# Altium project KOM_ACB23_4009.PrjPcb (part 1 of 2)
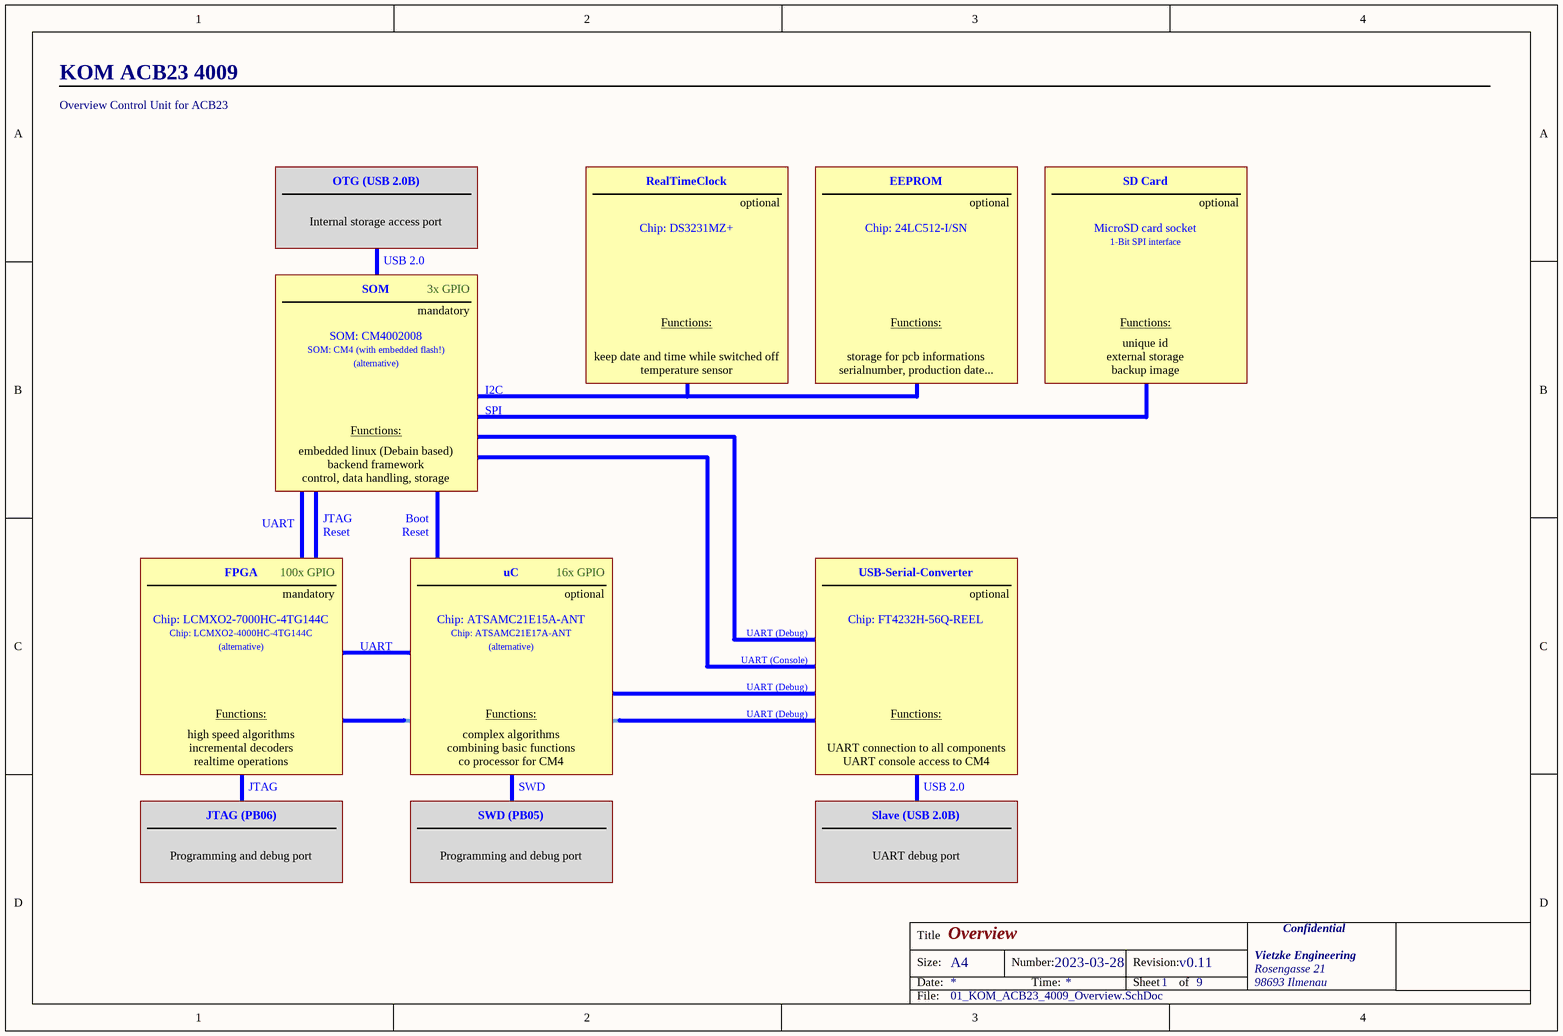
[diagram p0: 01_KOM_ACB23_4009_Overview.SchDoc]
9 sheets, 118 parts. Net scope: flat (ports and power ports of the same name join across sheets).
Board file: ZZ_KOM_ACB23_4009.PcbDoc
Sheets:
  01_KOM_ACB23_4009_Overview.SchDoc
  02_KOM_ACB23_4009_Overview_PCB.SchDoc
  03_KOM_ACB23_4009_Remarks.SchDoc
  04_KOM_ACB23_4009_AdditionalComponents.SchDoc
  05_KOM_ACB23_4009_MicroController.SchDoc
  06_KOM_ACB23_4009_FPGA.SchDoc
  07_KOM_ACB23_4009_ComputeModule.SchDoc
  08_KOM_ACB23_4009_Connectors.SchDoc
  09_KOM_ACB23_4009_Periphery.SchDoc

## Sheet 01_KOM_ACB23_4009_Overview.SchDoc: Overview
size A4; DocumentNumber: 2023-03-28; Revision: v0.11; SheetNumber: 1; SheetTotal: 9

### Notes on the sheet
- KOM ACB23 4009
- Overview Control Unit for ACB23
- OTG (USB 2.0B)
- RealTimeClock
- EEPROM
- SD Card
- Internal storage access port
- Chip: DS3231MZ+
- optional
- Chip: 24LC512-I/SN
- MicroSD card socket
- 1-Bit SPI interface
- SOM
- USB 2.0
- mandatory
- 3x GPIO
- SOM: CM4002008
- SOM: CM4 (with embedded flash!)
- (alternative)
- I2C
- keep date and time while switched off
- Functions:
- temperature sensor
- storage for pcb informations
- serialnumber, production date...
- backup image
- external storage
- unique id
- embedded linux (Debain based)
- SPI
- JTAG
- control, data handling, storage
- backend framework
- Boot
- FPGA
- UART
- Reset
- 100x GPIO
- uC
- 16x GPIO
- USB-Serial-Converter
- Chip: LCMXO2-7000HC-4TG144C
- Chip: LCMXO2-4000HC-4TG144C
- Chip: ATSAMC21E15A-ANT
- Chip: ATSAMC21E17A-ANT
- UART (Debug)
- UART (Console)
- Chip: FT4232H-56Q-REEL
- realtime operations
- incremental decoders
- high speed algorithms
- co processor for CM4
- combining basic functions
- complex algorithms
- SWD
- UART console access to CM4
- UART connection to all components
- JTAG (PB06)
- Programming and debug port
- SWD (PB05)
- Slave (USB 2.0B)
- UART debug port
- Title
- Size:
- Date:
- A4
- Number:
- Time:
- Revision:
- Sheet
- of
- Vietzke Engineering
- Rosengasse 21
- 98693 Ilmenau
- Confidential
- File:

## Sheet 02_KOM_ACB23_4009_Overview_PCB.SchDoc: Overview PCB
size A4; DocumentNumber: 2023-03-28; Revision: v0.11; SheetNumber: 2; SheetTotal: 9
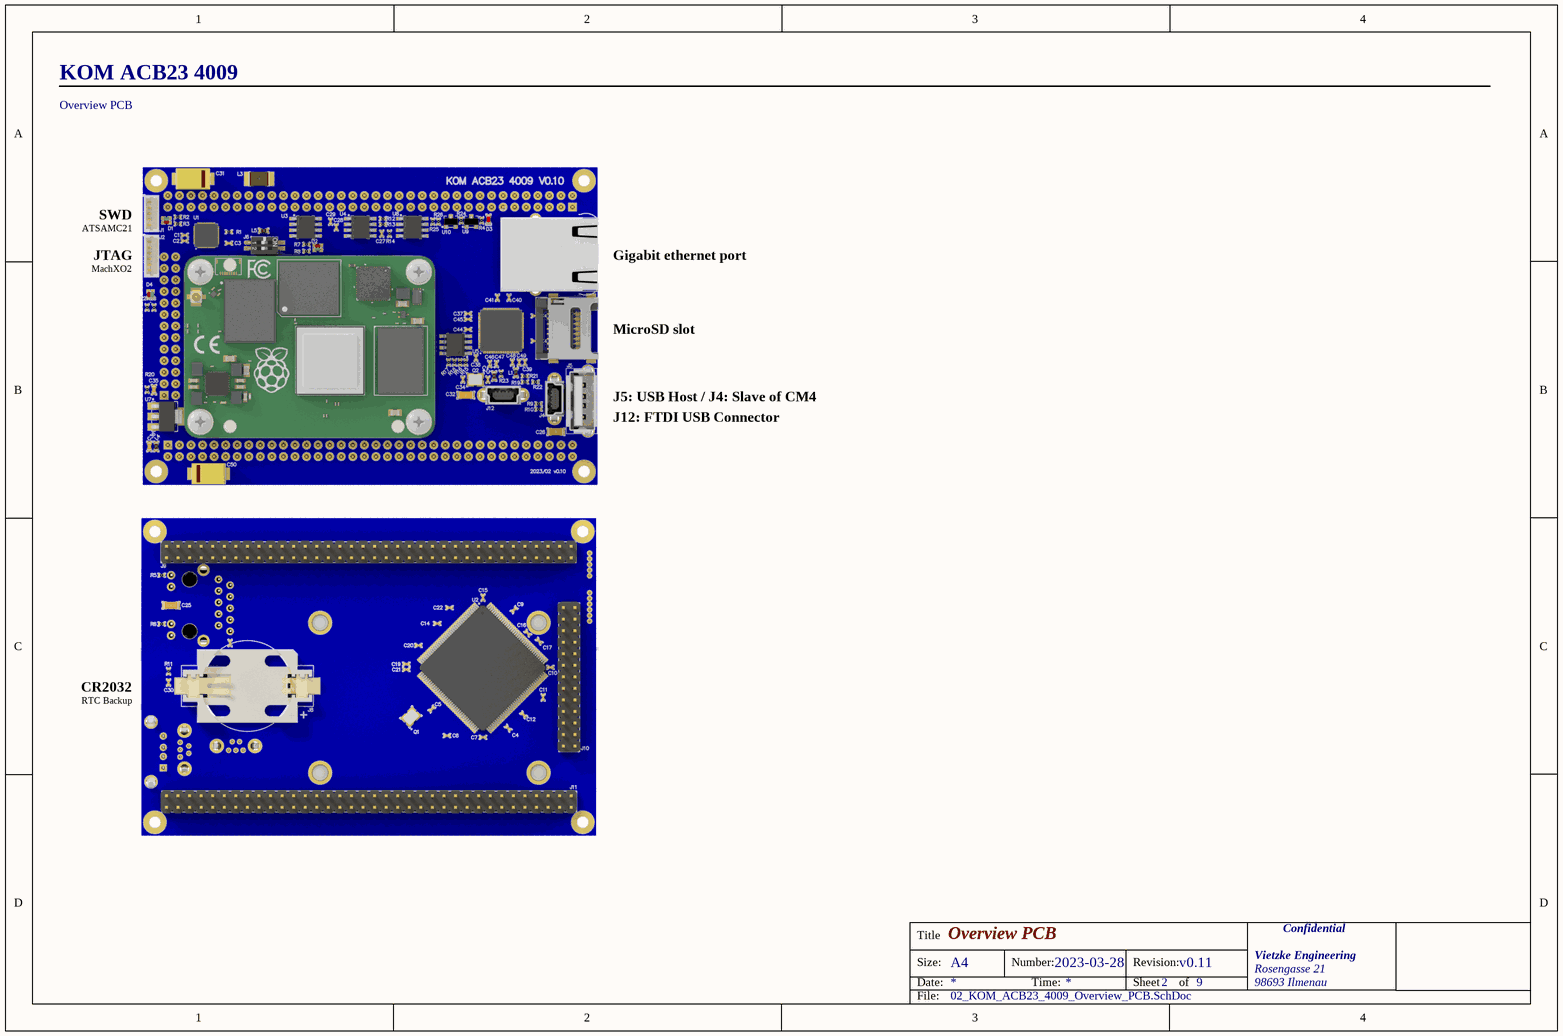
[diagram p1: 02_KOM_ACB23_4009_Overview_PCB.SchDoc]

### Notes on the sheet
- KOM ACB23 4009
- Overview PCB
- SWD
- JTAG
- ATSAMC21
- Gigabit ethernet port
- MachXO2
- MicroSD slot
- J5: USB Host / J4: Slave of CM4
- J12: FTDI USB Connector
- CR2032
- RTC Backup
- Title
- Size:
- Date:
- A4
- Number:
- Time:
- Revision:
- Sheet
- of
- Vietzke Engineering
- Rosengasse 21
- 98693 Ilmenau
- Confidential
- File:

## Sheet 03_KOM_ACB23_4009_Remarks.SchDoc: Remarks
size A4; DocumentNumber: 2023-03-28; Revision: v0.11; SheetNumber: 3; SheetTotal: 9
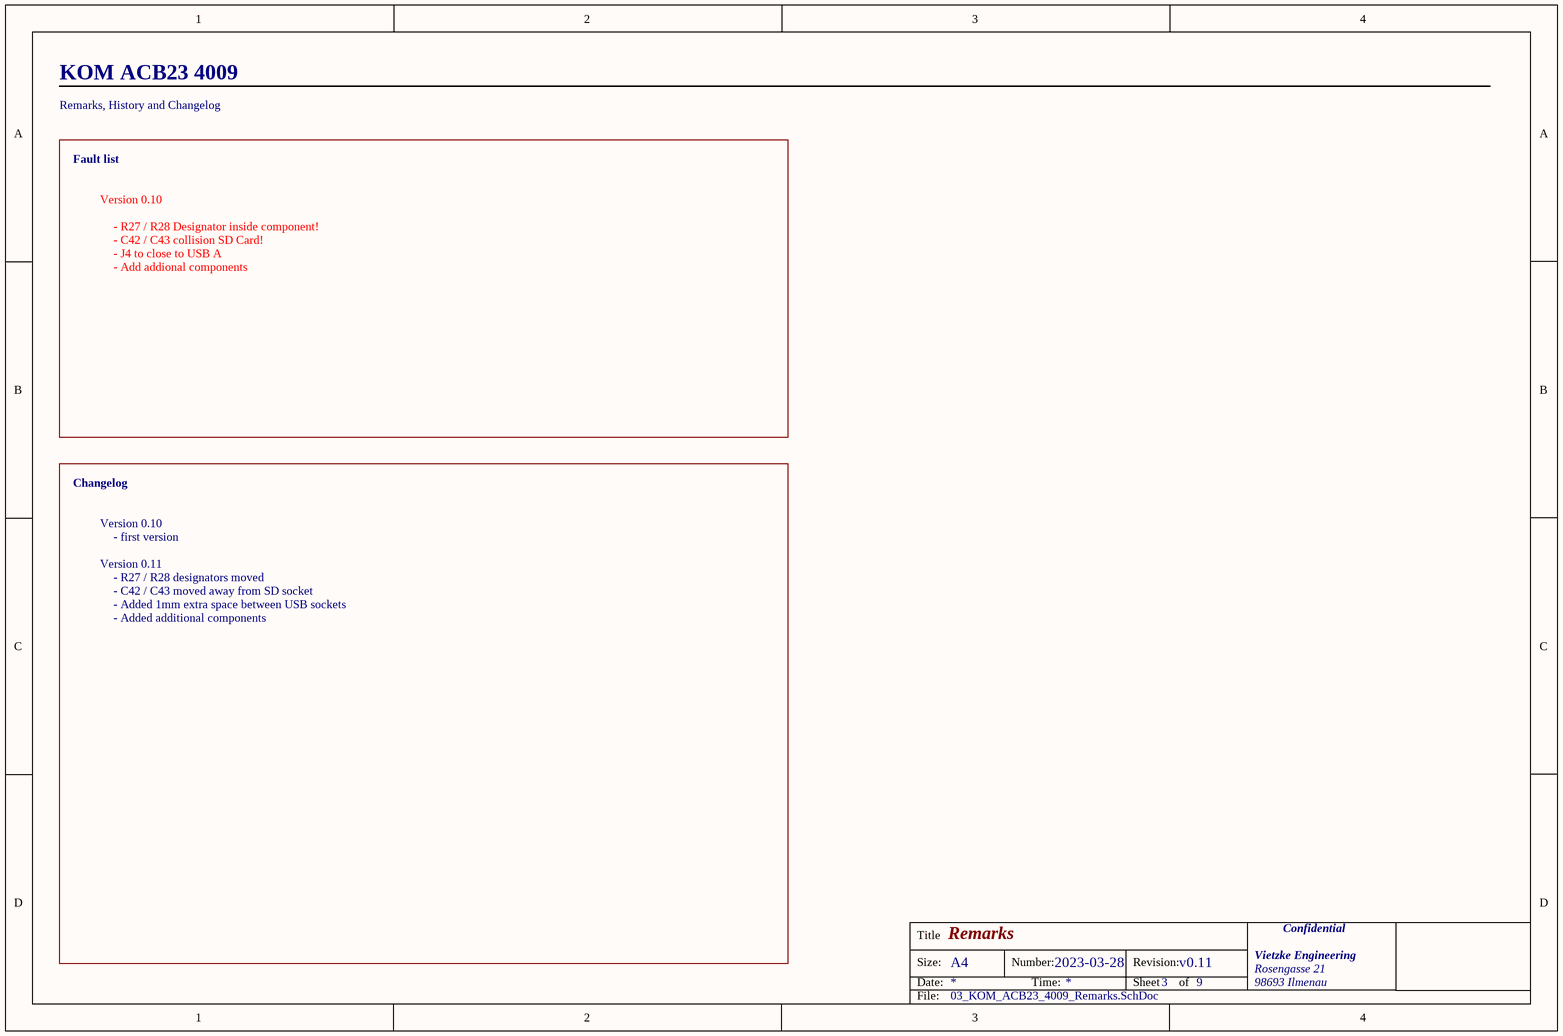
[diagram p2: 03_KOM_ACB23_4009_Remarks.SchDoc]

### Notes on the sheet
- KOM ACB23 4009
- Remarks, History and Changelog
- Fault list
- Version 0.10
- - R27 / R28 Designator inside component!
- - C42 / C43 collision SD Card!
- - J4 to close to USB A
- - Add addional components
- Changelog
- Version 0.11
- - first version
- - R27 / R28 designators moved
- - C42 / C43 moved away from SD socket
- - Added 1mm extra space between USB sockets
- - Added additional components
- Title
- Size:
- Date:
- A4
- Number:
- Time:
- Revision:
- Sheet
- of
- Vietzke Engineering
- Rosengasse 21
- 98693 Ilmenau
- Confidential
- File:

## Sheet 04_KOM_ACB23_4009_AdditionalComponents.SchDoc: Addtional components
size A4; DocumentNumber: 2023-03-28; Revision: v0.11; SheetNumber: 4; SheetTotal: 9
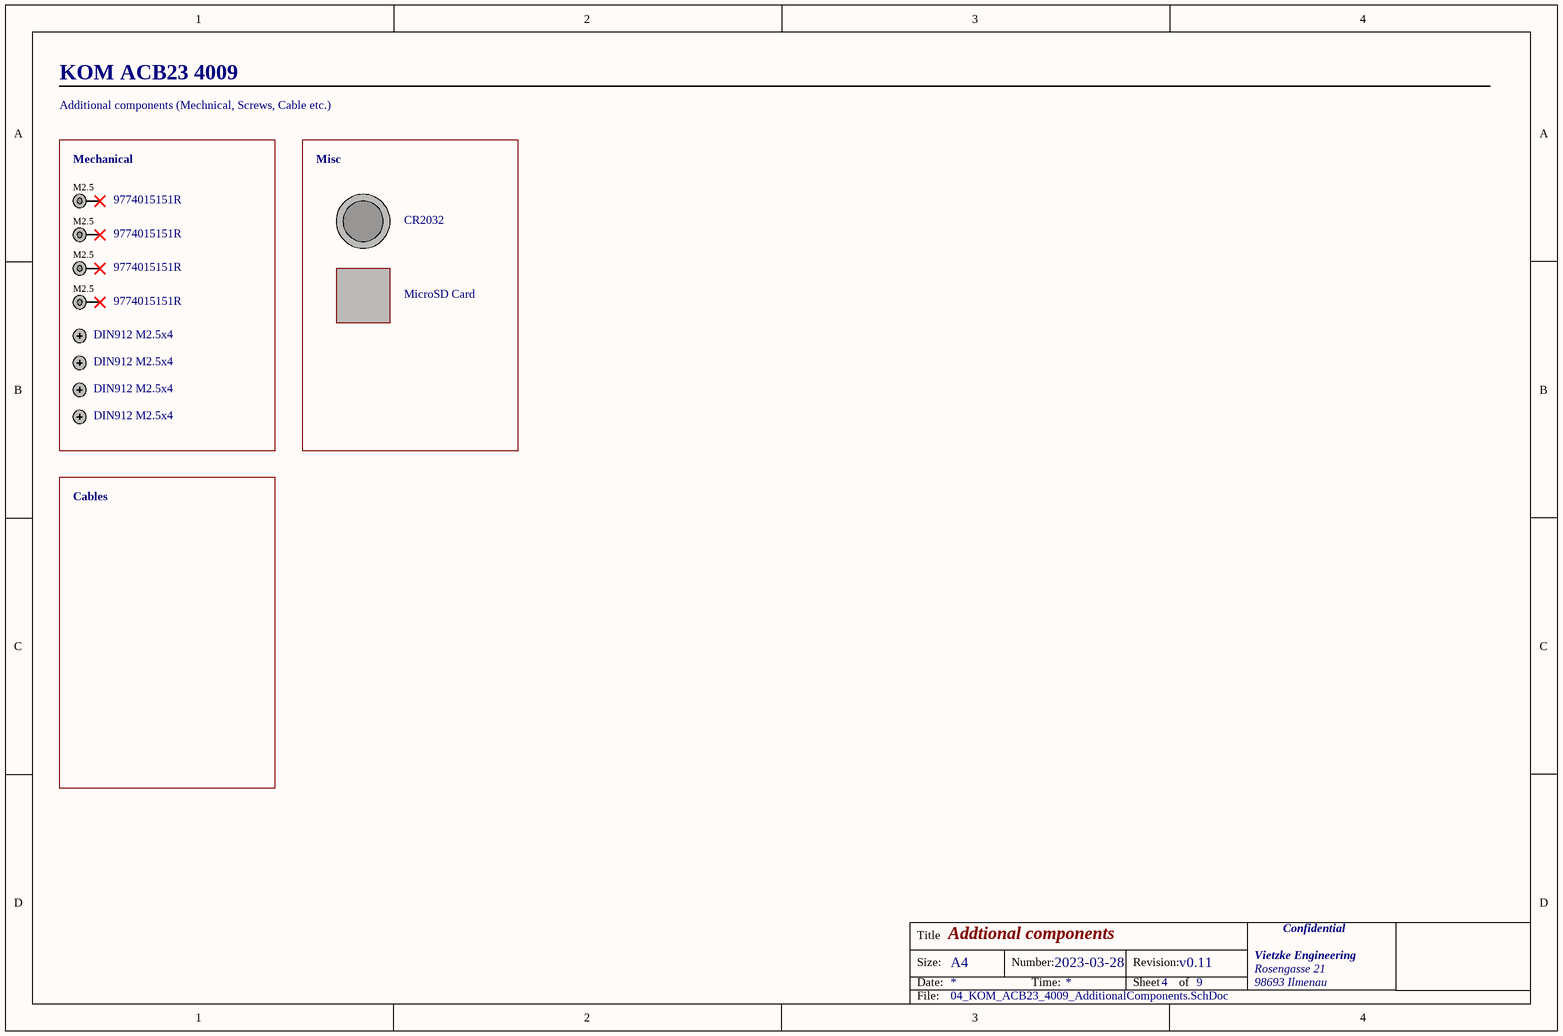
[diagram p3: 04_KOM_ACB23_4009_AdditionalComponents.SchDoc]

### Parts
BAT1  CR2032  [CR2032]
MH1  9774015151R  [9774015151R]
MH2  9774015151R  [9774015151R]
MH3  9774015151R  [9774015151R]
MH4  9774015151R  [9774015151R]
S1  DIN912 M2.5x4  [DIN912 M2.5x4]
S2  DIN912 M2.5x4  [DIN912 M2.5x4]
S3  DIN912 M2.5x4  [DIN912 M2.5x4]
S4  DIN912 M2.5x4  [DIN912 M2.5x4]
SD1  MicroSD Card  [MicroSDCard]

### Blocks framed on the sheet
Mechanical: MH1-MH4 S1-S4
Misc: BAT1 SD1

### Nets

Not connected (* = marked no-connect by the designer): MH1 1*; MH2 1*; MH3 1*; MH4 1*

### Notes on the sheet
- KOM ACB23 4009
- Additional components (Mechnical, Screws, Cable etc.)
- Cables
- Title
- Size:
- Date:
- A4
- Number:
- Time:
- Revision:
- Sheet
- of
- Vietzke Engineering
- Rosengasse 21
- 98693 Ilmenau
- Confidential
- File:
- (in symbol 9774015151R) M2.5

### Library data of the parts
BAT1 = CR2032: CR2032 Battery; Type: Mechanical
MH1-MH4 = 9774015151R: WA-SMSE SMD Steel M2.5 Internal 2.9mm; Type: THT; Supplier 1: Mouser; Supplier Part Number 1: 710-9774015151R
S1-S4 = DIN912 M2.5x4: Type: Mechanical
SD1 = MicroSD Card: Type: Mechanical

## Sheet 05_KOM_ACB23_4009_MicroController.SchDoc: MicroController
size A4; DocumentNumber: 2023-03-28; Revision: v0.11; SheetNumber: 5; SheetTotal: 9
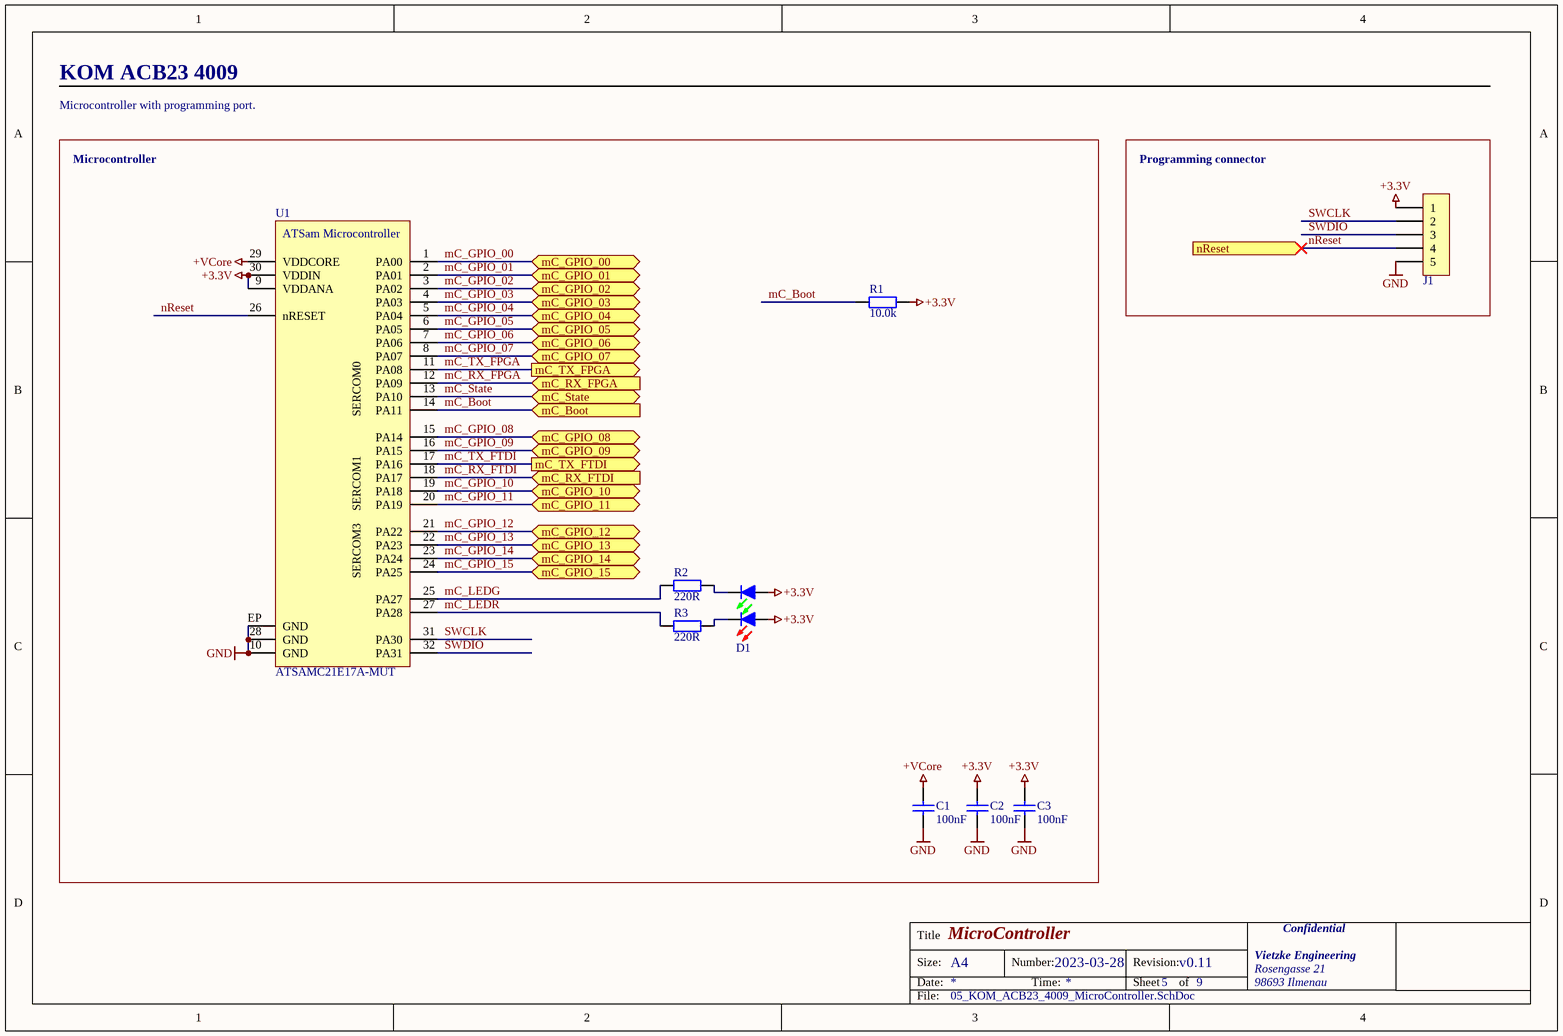
[diagram p4: 05_KOM_ACB23_4009_MicroController.SchDoc]

### Parts
C1  value 100nF  [C0402]  (hidden comment: C0402C104K3RACTU)
C2  value 100nF  [C0402]  (hidden comment: C0402C104K3RACTU)
C3  value 100nF  [C0402]  (hidden comment: C0402C104K3RACTU)
D1  LTST-C195KGJRKT  [SMD LED 0606 DUAL GREEN RED]  (value not drawn)
J1  53047-0510  [PicoBlade 01x05 THT Male]  (value not drawn)
R1  value 10.0k  [R0402]  (hidden comment: RC0402FR-0710KL)
R2  value 220R  [R0402]  (hidden comment: RC0402FR-07220RL)
R3  value 220R  [R0402]  (hidden comment: RC0402FR-07220RL)
U1  ATSAMC21E17A-MUT  [QFN32_5x5_0.50]

### Blocks framed on the sheet
Microcontroller: C1-C3 D1 R1-R3 U1
Programming connector: J1

### Ports
mC_Boot (in), mC_GPIO_00 (bidir), mC_GPIO_01 (bidir), mC_GPIO_02 (bidir), mC_GPIO_03 (bidir), mC_GPIO_04 (bidir), mC_GPIO_05 (bidir), mC_GPIO_06 (bidir), mC_GPIO_07 (bidir), mC_GPIO_08 (bidir), mC_GPIO_09 (bidir), mC_GPIO_10 (bidir), mC_GPIO_11 (bidir), mC_GPIO_12 (bidir), mC_GPIO_13 (bidir), mC_GPIO_14 (bidir), mC_GPIO_15 (bidir), mC_RX_FPGA (in), mC_RX_FTDI (in), mC_State (bidir), mC_TX_FPGA (out), mC_TX_FTDI (out), nReset (in)

### Nets
+3.3V: C2.2 C3.2 D1.1(AG) D1.2(AR) J1.1 R1.2 U1.9(VDDANA) U1.30(VDDIN)
+VCore: C1.2 U1.29(VDDCORE)
GND: C1.1 C2.1 C3.1 J1.5 U1.10(GND) U1.28(GND) U1.EP(GND)
mC_Boot: R1.1 U1.14(PA11) ; port mC_Boot
mC_GPIO_00: U1.1(PA00) ; port mC_GPIO_00
mC_GPIO_01: U1.2(PA01) ; port mC_GPIO_01
mC_GPIO_02: U1.3(PA02) ; port mC_GPIO_02
mC_GPIO_03: U1.4(PA03) ; port mC_GPIO_03
mC_GPIO_04: U1.5(PA04) ; port mC_GPIO_04
mC_GPIO_05: U1.6(PA05) ; port mC_GPIO_05
mC_GPIO_06: U1.7(PA06) ; port mC_GPIO_06
mC_GPIO_07: U1.8(PA07) ; port mC_GPIO_07
mC_GPIO_08: U1.15(PA14) ; port mC_GPIO_08
mC_GPIO_09: U1.16(PA15) ; port mC_GPIO_09
mC_GPIO_10: U1.19(PA18) ; port mC_GPIO_10
mC_GPIO_11: U1.20(PA19) ; port mC_GPIO_11
mC_GPIO_12: U1.21(PA22) ; port mC_GPIO_12
mC_GPIO_13: U1.22(PA23) ; port mC_GPIO_13
mC_GPIO_14: U1.23(PA24) ; port mC_GPIO_14
mC_GPIO_15: U1.24(PA25) ; port mC_GPIO_15
mC_LEDG: R2.1 U1.25(PA27)
mC_LEDR: R3.1 U1.27(PA28)
mC_RX_FPGA: U1.12(PA09) ; port mC_RX_FPGA
mC_RX_FTDI: U1.18(PA17) ; port mC_RX_FTDI
mC_State: U1.13(PA10) ; port mC_State
mC_TX_FPGA: U1.11(PA08) ; port mC_TX_FPGA
mC_TX_FTDI: U1.17(PA16) ; port mC_TX_FTDI
nReset: J1.4 U1.26(nRESET) ; port nReset
SWCLK: J1.2 U1.31(PA30)
SWDIO: J1.3 U1.32(PA31)
NetD1_3: D1.3(KG) R2.2
NetD1_4: D1.4(KR) R3.2

### Notes on the sheet
- KOM ACB23 4009
- Microcontroller with programming port.
- Title
- Size:
- Date:
- A4
- Number:
- Time:
- Revision:
- Sheet
- of
- Vietzke Engineering
- Rosengasse 21
- 98693 Ilmenau
- Confidential
- File:
- (in symbol ATSAMC21E17A-MUT) ATSam Microcontroller; SERCOM0; SERCOM1; SERCOM3

### Library data of the parts
C1-C3 = C0402C104K3RACTU: 0402 100nF 25.0V; Type: SMD; Package: 0402; Supplier 1: Mouser; Supplier Part Number 1: 80-C0402C104K3R
D1 = LTST-C195KGJRKT: SMD LED 0606 Dual RED GREEN; Type: SMD; Package: 0603; Supplier 1: Mouser; Supplier Part Number 1: 859-LTST-C195KGJRKT
J1 = 53047-0510: PicoBlade 01x05 Male THT; Type: THT; Package: -; Supplier 1: Mouser; Supplier Part Number 1: 538-53047-0510
R1 = RC0402FR-0710KL: 0402 10.0K; Type: SMD; Package: 0402; Supplier 1: Mouser; Supplier Part Number 1: 603-RC0402FR-0710KL
R2 R3 = RC0402FR-07220RL: 0402 220R; Type: SMD; Package: 0402; Supplier 1: Mouser; Supplier Part Number 1: 603-RC0402FR-07220RL
U1 = ATSAMC21E17A-MUT: 32-Bit ATSam ARM 128KB Flash; Type: SMD; Package: QFN32; Supplier 1: Mouser; Supplier Part Number 1: 556-ATSAMC21E17A-MUT

## Sheet 06_KOM_ACB23_4009_FPGA.SchDoc: FPGA
size A4; DocumentNumber: 2023-03-28; Revision: v0.11; SheetNumber: 6; SheetTotal: 9
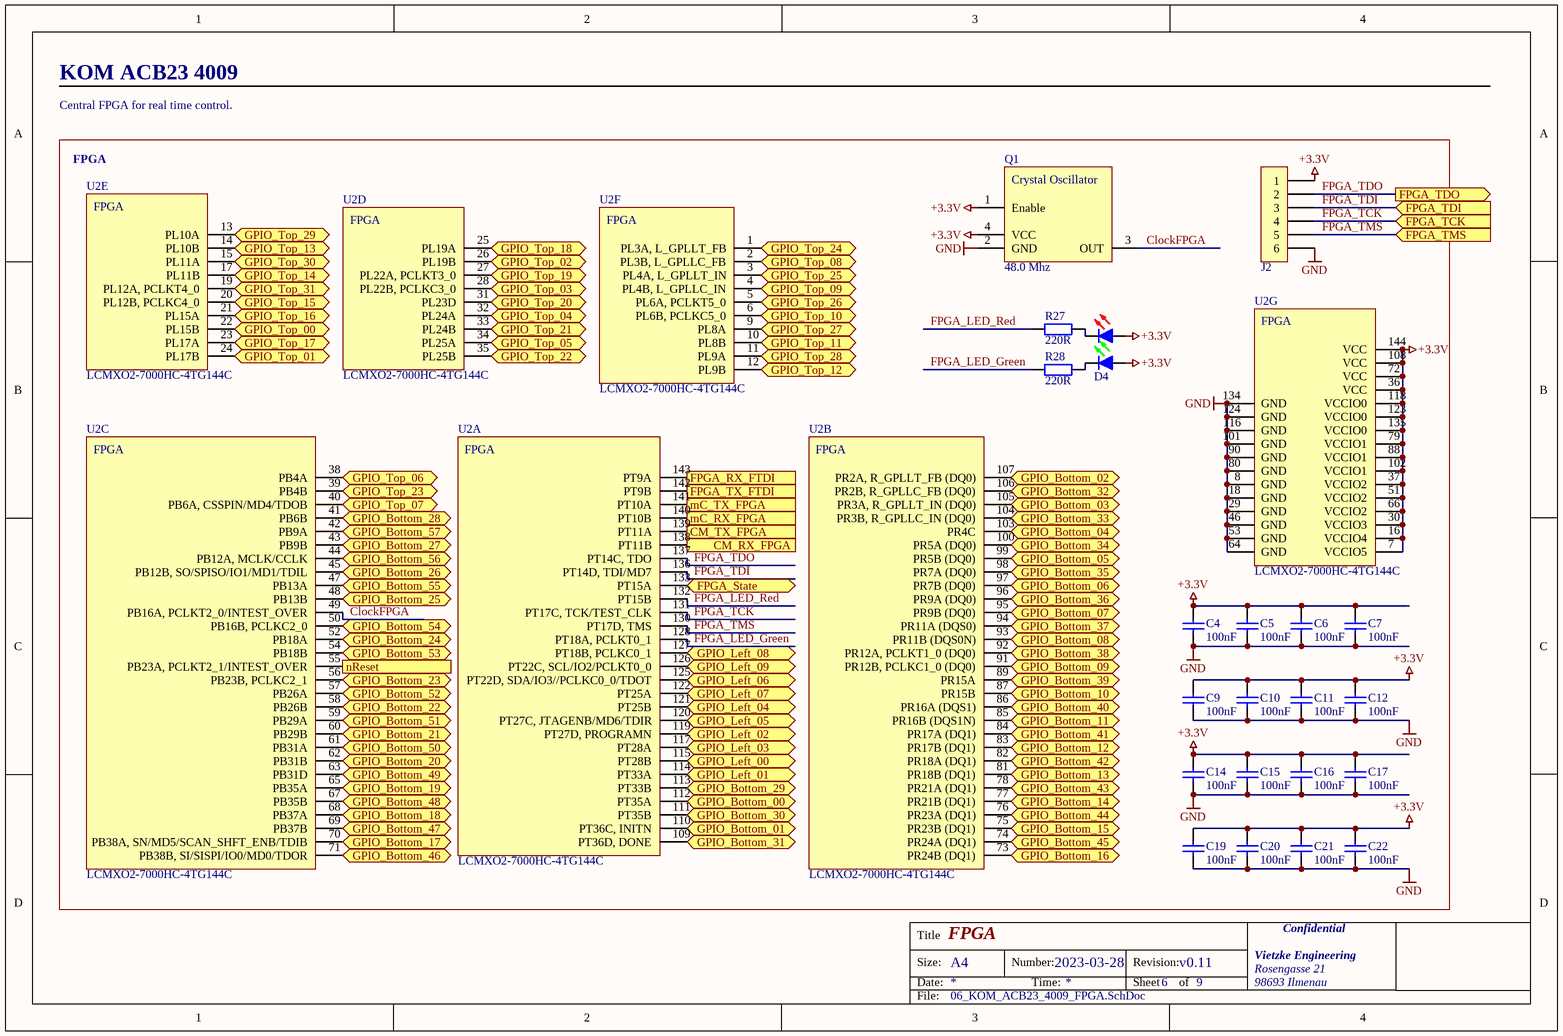
[diagram p5: 06_KOM_ACB23_4009_FPGA.SchDoc]

### Parts
C4  value 100nF  [C0402]  (hidden comment: C0402C104K3RACTU)
C5  value 100nF  [C0402]  (hidden comment: C0402C104K3RACTU)
C6  value 100nF  [C0402]  (hidden comment: C0402C104K3RACTU)
C7  value 100nF  [C0402]  (hidden comment: C0402C104K3RACTU)
C9  value 100nF  [C0402]  (hidden comment: C0402C104K3RACTU)
C10  value 100nF  [C0402]  (hidden comment: C0402C104K3RACTU)
C11  value 100nF  [C0402]  (hidden comment: C0402C104K3RACTU)
C12  value 100nF  [C0402]  (hidden comment: C0402C104K3RACTU)
C14  value 100nF  [C0402]  (hidden comment: C0402C104K3RACTU)
C15  value 100nF  [C0402]  (hidden comment: C0402C104K3RACTU)
C16  value 100nF  [C0402]  (hidden comment: C0402C104K3RACTU)
C17  value 100nF  [C0402]  (hidden comment: C0402C104K3RACTU)
C19  value 100nF  [C0402]  (hidden comment: C0402C104K3RACTU)
C20  value 100nF  [C0402]  (hidden comment: C0402C104K3RACTU)
C21  value 100nF  [C0402]  (hidden comment: C0402C104K3RACTU)
C22  value 100nF  [C0402]  (hidden comment: C0402C104K3RACTU)
D4  LTST-C195KGJRKT  [SMD LED 0606 DUAL GREEN RED]  (value not drawn)
J2  53047-0610  [PicoBlade 01x06 THT Male]  (value not drawn)
Q1  value 48.0 Mhz  [Crystal_3.2x2.5]  (hidden comment: ECS-3225MV-480-CN-TR)
R27  value 220R  [R0402]  (hidden comment: RC0402FR-07220RL)
R28  value 220R  [R0402]  (hidden comment: RC0402FR-07220RL)
U2  LCMXO2-7000HC-4TG144C  [TQFP-144_20x20_P0.5]  (parts A,B,C,D,E,F,G of 7)

### Blocks framed on the sheet
FPGA: C4-C7 C9-C12 C14-C17 C19-C22 D4 J2 Q1 R27 R28 U2

### Ports
CM_RX_FPGA (out), CM_TX_FPGA (in), FPGA_RX_FTDI (in), FPGA_State (bidir), FPGA_TCK (in), FPGA_TDI (in), FPGA_TDO (out), FPGA_TMS (in), FPGA_TX_FTDI (out), GPIO_Bottom_00 (bidir), GPIO_Bottom_01 (bidir), GPIO_Bottom_02 (bidir), GPIO_Bottom_03 (bidir), GPIO_Bottom_04 (bidir), GPIO_Bottom_05 (bidir), GPIO_Bottom_06 (bidir), GPIO_Bottom_07 (bidir), GPIO_Bottom_08 (bidir), GPIO_Bottom_09 (bidir), GPIO_Bottom_10 (bidir), GPIO_Bottom_11 (bidir), GPIO_Bottom_12 (bidir), GPIO_Bottom_13 (bidir), GPIO_Bottom_14 (bidir), GPIO_Bottom_15 (bidir), GPIO_Bottom_16 (bidir), GPIO_Bottom_17 (bidir), GPIO_Bottom_18 (bidir), GPIO_Bottom_19 (bidir), GPIO_Bottom_20 (bidir), GPIO_Bottom_21 (bidir), GPIO_Bottom_22 (bidir), GPIO_Bottom_23 (bidir), GPIO_Bottom_24 (bidir), GPIO_Bottom_25 (bidir), GPIO_Bottom_26 (bidir), GPIO_Bottom_27 (bidir), GPIO_Bottom_28 (bidir), GPIO_Bottom_29 (bidir), GPIO_Bottom_30 (bidir), GPIO_Bottom_31 (bidir), GPIO_Bottom_32 (bidir), GPIO_Bottom_33 (bidir), GPIO_Bottom_34 (bidir), GPIO_Bottom_35 (bidir), GPIO_Bottom_36 (bidir), GPIO_Bottom_37 (bidir), GPIO_Bottom_38 (bidir), GPIO_Bottom_39 (bidir), GPIO_Bottom_40 (bidir), GPIO_Bottom_41 (bidir), GPIO_Bottom_42 (bidir), GPIO_Bottom_43 (bidir), GPIO_Bottom_44 (bidir), GPIO_Bottom_45 (bidir), GPIO_Bottom_46 (bidir), GPIO_Bottom_47 (bidir), GPIO_Bottom_48 (bidir), GPIO_Bottom_49 (bidir), GPIO_Bottom_50 (bidir), GPIO_Bottom_51 (bidir), GPIO_Bottom_52 (bidir), GPIO_Bottom_53 (bidir), GPIO_Bottom_54 (bidir), GPIO_Bottom_55 (bidir), GPIO_Bottom_56 (bidir), GPIO_Bottom_57 (bidir), GPIO_Left_00 (bidir), GPIO_Left_01 (bidir), GPIO_Left_02 (bidir), GPIO_Left_03 (bidir), GPIO_Left_04 (bidir), GPIO_Left_05 (bidir), GPIO_Left_06 (bidir), GPIO_Left_07 (bidir), GPIO_Left_08 (bidir), GPIO_Left_09 (bidir), GPIO_Top_00 (bidir), GPIO_Top_01 (bidir), GPIO_Top_02 (bidir), GPIO_Top_03 (bidir), GPIO_Top_04 (bidir), GPIO_Top_05 (bidir), GPIO_Top_06 (bidir), GPIO_Top_07 (bidir), GPIO_Top_08 (bidir), GPIO_Top_09 (bidir), GPIO_Top_10 (bidir), GPIO_Top_11 (bidir), GPIO_Top_12 (bidir), GPIO_Top_13 (bidir), GPIO_Top_14 (bidir), GPIO_Top_15 (bidir), GPIO_Top_16 (bidir), GPIO_Top_17 (bidir), GPIO_Top_18 (bidir), GPIO_Top_19 (bidir), GPIO_Top_20 (bidir), GPIO_Top_21 (bidir), GPIO_Top_22 (bidir), GPIO_Top_23 (bidir), GPIO_Top_24 (bidir), GPIO_Top_25 (bidir), GPIO_Top_26 (bidir), GPIO_Top_27 (bidir), GPIO_Top_28 (bidir), GPIO_Top_29 (bidir), GPIO_Top_30 (bidir), GPIO_Top_31 (bidir), mC_RX_FPGA (out), mC_TX_FPGA (in), nReset (in)

### Nets
+3.3V: C4.2 C5.2 C6.2 C7.2 C9.2 C10.2 C11.2 C12.2 C14.2 C15.2 C16.2 C17.2 C19.2 C20.2 C21.2 C22.2 D4.1(AG) D4.2(AR) J2.1 Q1.1(Enable) Q1.4(VCC) U2.7(VCCIO5) U2.16(VCCIO4) U2.30(VCCIO3) U2.36(VCC) U2.37(VCCIO2) U2.51(VCCIO2) U2.66(VCCIO2) U2.72(VCC) U2.79(VCCIO1) U2.88(VCCIO1) U2.102(VCCIO1) U2.108(VCC) U2.118(VCCIO0) U2.123(VCCIO0) U2.135(VCCIO0) U2.144(VCC)
GND: C4.1 C5.1 C6.1 C7.1 C9.1 C10.1 C11.1 C12.1 C14.1 C15.1 C16.1 C17.1 C19.1 C20.1 C21.1 C22.1 J2.6 Q1.2(GND) U2.8(GND) U2.18(GND) U2.29(GND) U2.46(GND) U2.53(GND) U2.64(GND) U2.80(GND) U2.90(GND) U2.101(GND) U2.116(GND) U2.124(GND) U2.134(GND)
ClockFPGA: Q1.3(OUT) U2.49(PB16A,_PCLKT2_0/INTEST_OVER)
CM_RX_FPGA: U2.138(PT11B) ; port CM_RX_FPGA
CM_TX_FPGA: U2.139(PT11A) ; port CM_TX_FPGA
FPGA_LED_Green: R28.1 U2.128(PT18A,_PCLKT0_1)
FPGA_LED_Red: R27.1 U2.132(PT15B)
FPGA_State: U2.133(PT15A) ; port FPGA_State
FPGA_TCK: J2.4 U2.131(PT17C,_TCK/TEST_CLK) ; port FPGA_TCK
FPGA_TDI: J2.3 U2.136(PT14D,_TDI/MD7) ; port FPGA_TDI
FPGA_TDO: J2.2 U2.137(PT14C,_TDO) ; port FPGA_TDO
FPGA_TMS: J2.5 U2.130(PT17D,_TMS) ; port FPGA_TMS
mC_RX_FPGA: U2.140(PT10B) ; port mC_RX_FPGA
mC_TX_FPGA: U2.141(PT10A) ; port mC_TX_FPGA
nReset: U2.55(PB23A,_PCLKT2_1/INTEST_OVER) ; port nReset
NetD4_3: D4.3(KG) R28.2
NetD4_4: D4.4(KR) R27.2
NetJ9_9: U2.40(PB6A,_CSSPIN/MD4/TDOB) ; port GPIO_Top_07
NetJ9_10: U2.39(PB4B) ; port GPIO_Top_23
NetJ9_11: U2.38(PB4A) ; port GPIO_Top_06
NetJ9_12: U2.35(PL25B) ; port GPIO_Top_22
NetJ9_13: U2.34(PL25A) ; port GPIO_Top_05
NetJ9_14: U2.33(PL24B) ; port GPIO_Top_21
NetJ9_15: U2.32(PL24A) ; port GPIO_Top_04
NetJ9_16: U2.31(PL23D) ; port GPIO_Top_20
NetJ9_17: U2.28(PL22B,_PCLKC3_0) ; port GPIO_Top_03
NetJ9_18: U2.27(PL22A,_PCLKT3_0) ; port GPIO_Top_19
NetJ9_19: U2.26(PL19B) ; port GPIO_Top_02
NetJ9_20: U2.25(PL19A) ; port GPIO_Top_18
NetJ9_21: U2.24(PL17B) ; port GPIO_Top_01
NetJ9_22: U2.23(PL17A) ; port GPIO_Top_17
NetJ9_23: U2.22(PL15B) ; port GPIO_Top_00
NetJ9_24: U2.21(PL15A) ; port GPIO_Top_16
NetJ9_25: U2.20(PL12B,_PCLKC4_0) ; port GPIO_Top_15
NetJ9_26: U2.19(PL12A,_PCLKT4_0) ; port GPIO_Top_31
NetJ9_27: U2.17(PL11B) ; port GPIO_Top_14
NetJ9_28: U2.15(PL11A) ; port GPIO_Top_30
NetJ9_29: U2.14(PL10B) ; port GPIO_Top_13
NetJ9_30: U2.13(PL10A) ; port GPIO_Top_29
NetJ9_31: U2.12(PL9B) ; port GPIO_Top_12
NetJ9_32: U2.11(PL9A) ; port GPIO_Top_28
NetJ9_33: U2.10(PL8B) ; port GPIO_Top_11
NetJ9_34: U2.9(PL8A) ; port GPIO_Top_27
NetJ9_35: U2.6(PL6B,_PCLKC5_0) ; port GPIO_Top_10
NetJ9_36: U2.5(PL6A,_PCLKT5_0) ; port GPIO_Top_26
NetJ9_37: U2.4(PL4B,_L_GPLLC_IN) ; port GPIO_Top_09
NetJ9_38: U2.3(PL4A,_L_GPLLT_IN) ; port GPIO_Top_25
NetJ9_39: U2.2(PL3B,_L_GPLLC_FB) ; port GPIO_Top_08
NetJ9_40: U2.1(PL3A,_L_GPLLT_FB) ; port GPIO_Top_24
NetJ10_1: U2.114(PT33A) ; port GPIO_Left_01
NetJ10_2: U2.115(PT28B) ; port GPIO_Left_00
NetJ10_3: U2.117(PT28A) ; port GPIO_Left_03
NetJ10_4: U2.119(PT27D,_PROGRAMN) ; port GPIO_Left_02
NetJ10_5: U2.120(PT27C,_JTAGENB/MD6/TDIR) ; port GPIO_Left_05
NetJ10_6: U2.121(PT25B) ; port GPIO_Left_04
NetJ10_7: U2.122(PT25A) ; port GPIO_Left_07
NetJ10_8: U2.125(PT22D,_SDA/IO3//PCLKC0_0/TDOT) ; port GPIO_Left_06
NetJ10_10: U2.126(PT22C,_SCL/IO2/PCLKT0_0) ; port GPIO_Left_09
NetJ10_12: U2.127(PT18B,_PCLKC0_1) ; port GPIO_Left_08
NetJ11_9: U2.112(PT35A) ; port GPIO_Bottom_00
NetJ11_10: U2.113(PT33B) ; port GPIO_Bottom_29
NetJ11_11: U2.110(PT36C,_INITN) ; port GPIO_Bottom_01
NetJ11_12: U2.111(PT35B) ; port GPIO_Bottom_30
NetJ11_13: U2.107(PR2A,_R_GPLLT_FB_(DQ0)) ; port GPIO_Bottom_02
NetJ11_14: U2.109(PT36D,_DONE) ; port GPIO_Bottom_31
NetJ11_15: U2.105(PR3A,_R_GPLLT_IN_(DQ0)) ; port GPIO_Bottom_03
NetJ11_16: U2.106(PR2B,_R_GPLLC_FB_(DQ0)) ; port GPIO_Bottom_32
NetJ11_17: U2.103(PR4C) ; port GPIO_Bottom_04
NetJ11_18: U2.104(PR3B,_R_GPLLC_IN_(DQ0)) ; port GPIO_Bottom_33
NetJ11_19: U2.99(PR5B_(DQ0)) ; port GPIO_Bottom_05
NetJ11_20: U2.100(PR5A_(DQ0)) ; port GPIO_Bottom_34
NetJ11_21: U2.97(PR7B_(DQ0)) ; port GPIO_Bottom_06
NetJ11_22: U2.98(PR7A_(DQ0)) ; port GPIO_Bottom_35
NetJ11_23: U2.95(PR9B_(DQ0)) ; port GPIO_Bottom_07
NetJ11_24: U2.96(PR9A_(DQ0)) ; port GPIO_Bottom_36
NetJ11_25: U2.93(PR11B_(DQS0N)) ; port GPIO_Bottom_08
NetJ11_26: U2.94(PR11A_(DQS0)) ; port GPIO_Bottom_37
NetJ11_27: U2.91(PR12B,_PCLKC1_0_(DQ0)) ; port GPIO_Bottom_09
NetJ11_28: U2.92(PR12A,_PCLKT1_0_(DQ0)) ; port GPIO_Bottom_38
NetJ11_29: U2.87(PR15B) ; port GPIO_Bottom_10
NetJ11_30: U2.89(PR15A) ; port GPIO_Bottom_39
NetJ11_33: U2.85(PR16B_(DQS1N)) ; port GPIO_Bottom_11
NetJ11_34: U2.86(PR16A_(DQS1)) ; port GPIO_Bottom_40
NetJ11_35: U2.83(PR17B_(DQ1)) ; port GPIO_Bottom_12
NetJ11_36: U2.84(PR17A_(DQ1)) ; port GPIO_Bottom_41
NetJ11_37: U2.81(PR18B_(DQ1)) ; port GPIO_Bottom_13
NetJ11_38: U2.82(PR18A_(DQ1)) ; port GPIO_Bottom_42
NetJ11_39: U2.77(PR21B_(DQ1)) ; port GPIO_Bottom_14
NetJ11_40: U2.78(PR21A_(DQ1)) ; port GPIO_Bottom_43
NetJ11_41: U2.75(PR23B_(DQ1)) ; port GPIO_Bottom_15
NetJ11_42: U2.76(PR23A_(DQ1)) ; port GPIO_Bottom_44
NetJ11_43: U2.73(PR24B_(DQ1)) ; port GPIO_Bottom_16
NetJ11_44: U2.74(PR24A_(DQ1)) ; port GPIO_Bottom_45
NetJ11_45: U2.70(PB38A,_SN/MD5/SCAN_SHFT_ENB/TDIB) ; port GPIO_Bottom_17
NetJ11_46: U2.71(PB38B,_SI/SISPI/IO0/MD0/TDOR) ; port GPIO_Bottom_46
NetJ11_47: U2.68(PB37A) ; port GPIO_Bottom_18
NetJ11_48: U2.69(PB37B) ; port GPIO_Bottom_47
NetJ11_49: U2.65(PB35A) ; port GPIO_Bottom_19
NetJ11_50: U2.67(PB35B) ; port GPIO_Bottom_48
NetJ11_53: U2.62(PB31B) ; port GPIO_Bottom_20
NetJ11_54: U2.63(PB31D) ; port GPIO_Bottom_49
NetJ11_55: U2.60(PB29B) ; port GPIO_Bottom_21
NetJ11_56: U2.61(PB31A) ; port GPIO_Bottom_50
NetJ11_57: U2.58(PB26B) ; port GPIO_Bottom_22
NetJ11_58: U2.59(PB29A) ; port GPIO_Bottom_51
NetJ11_59: U2.56(PB23B,_PCLKC2_1) ; port GPIO_Bottom_23
NetJ11_60: U2.57(PB26A) ; port GPIO_Bottom_52
NetJ11_63: U2.52(PB18A) ; port GPIO_Bottom_24
NetJ11_64: U2.54(PB18B) ; port GPIO_Bottom_53
NetJ11_65: U2.48(PB13B) ; port GPIO_Bottom_25
NetJ11_66: U2.50(PB16B,_PCLKC2_0) ; port GPIO_Bottom_54
NetJ11_67: U2.45(PB12B,_SO/SPISO/IO1/MD1/TDIL) ; port GPIO_Bottom_26
NetJ11_68: U2.47(PB13A) ; port GPIO_Bottom_55
NetJ11_69: U2.43(PB9B) ; port GPIO_Bottom_27
NetJ11_70: U2.44(PB12A,_MCLK/CCLK) ; port GPIO_Bottom_56
NetJ11_71: U2.41(PB6B) ; port GPIO_Bottom_28
NetJ11_72: U2.42(PB9A) ; port GPIO_Bottom_57
NetU2_142: U2.142(PT9B) ; port FPGA_TX_FTDI
NetU2_143: U2.143(PT9A) ; port FPGA_RX_FTDI

### Notes on the sheet
- KOM ACB23 4009
- Central FPGA for real time control.
- Title
- Size:
- Date:
- A4
- Number:
- Time:
- Revision:
- Sheet
- of
- Vietzke Engineering
- Rosengasse 21
- 98693 Ilmenau
- Confidential
- File:
- (in symbol ECS-3225MV-480-CN-TR) Crystal Oscillator
- (in symbol LCMXO2-7000HC-4TG144C, part A) FPGA
- (in symbol LCMXO2-7000HC-4TG144C, part B) FPGA
- (in symbol LCMXO2-7000HC-4TG144C, part C) FPGA
- (in symbol LCMXO2-7000HC-4TG144C, part D) FPGA
- (in symbol LCMXO2-7000HC-4TG144C, part E) FPGA
- (in symbol LCMXO2-7000HC-4TG144C, part F) FPGA
- (in symbol LCMXO2-7000HC-4TG144C, part G) FPGA

### Library data of the parts
C4-C7 C9-C12 C14-C17 C19-C22 = C0402C104K3RACTU: 0402 100nF 25.0V; Type: SMD; Package: 0402; Supplier 1: Mouser; Supplier Part Number 1: 80-C0402C104K3R
D4 = LTST-C195KGJRKT: SMD LED 0606 Dual RED GREEN; Type: SMD; Package: 0603; Supplier 1: Mouser; Supplier Part Number 1: 859-LTST-C195KGJRKT
J2 = 53047-0610: PicoBlade 01x06 Male THT; Type: THT; Package: -; Supplier 1: Mouser; Supplier Part Number 1: 538-53047-0610
Q1 = ECS-3225MV-480-CN-TR: Oscillator 48 Mhz 3.2 x 2.5; Type: SMD; Package: 3.2x2.5; Supplier 1: Mouser; Supplier Part Number 1: 520-3225MV-480-CNT
R27 R28 = RC0402FR-07220RL: 0402 220R; Type: SMD; Package: 0402; Supplier 1: Mouser; Supplier Part Number 1: 603-RC0402FR-07220RL
U2 = LCMXO2-7000HC-4TG144C: MachXO2 High Performance; 7000 LUTs; 3.3V; Type: SMD; Package: TQFP-144; Supplier 1: Mouser; Supplier Part Number 1: 842-27000HC4TG144C

## Sheet 07_KOM_ACB23_4009_ComputeModule.SchDoc: ComputeModule
size A4; DocumentNumber: 2023-03-28; Revision: v0.11; SheetNumber: 7; SheetTotal: 9
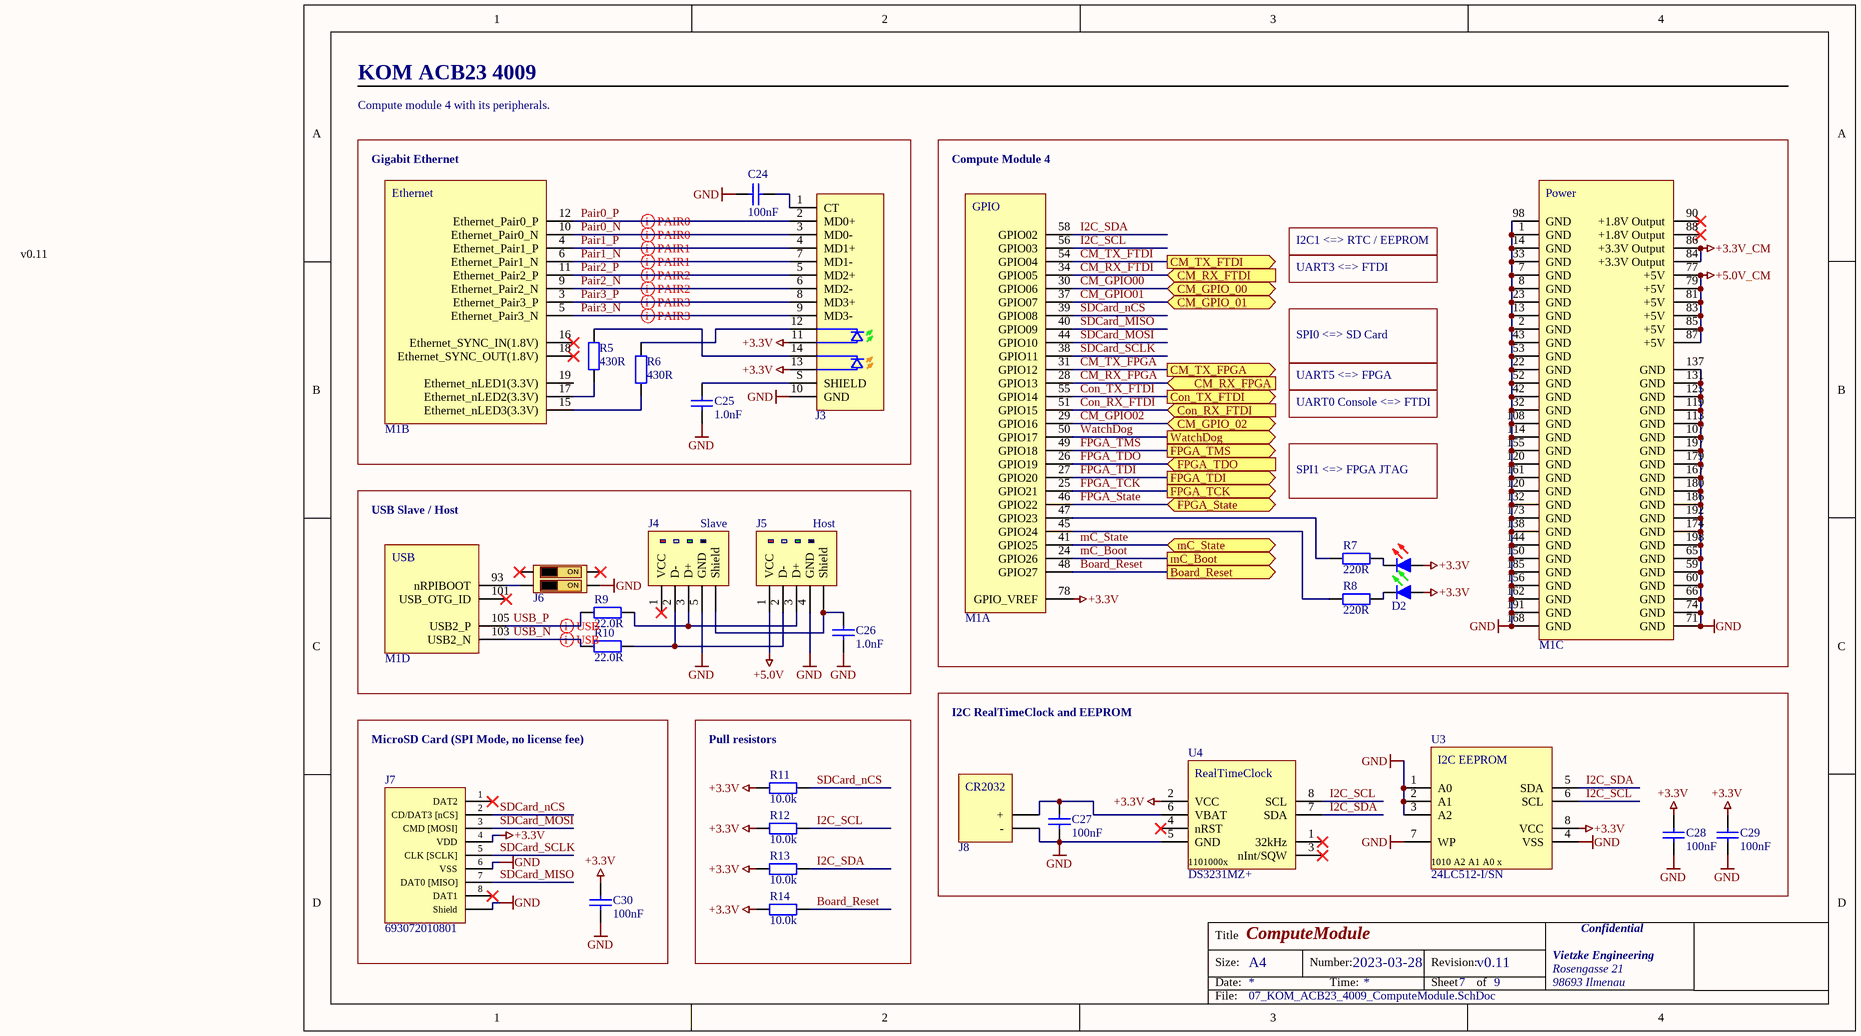
[diagram p6: 07_KOM_ACB23_4009_ComputeModule.SchDoc]

### Parts
C24  value 100nF  [C0402]  (hidden comment: C0402C104K3RACTU)
C25  value 1.0nF  [C1206]  (hidden comment: CC1206KKX7RSBB102)
C26  value 1.0nF  [C1206]  (hidden comment: CC1206KKX7RSBB102)
C27  value 100nF  [C0402]  (hidden comment: C0402C104K3RACTU)
C28  value 100nF  [C0402]  (hidden comment: C0402C104K3RACTU)
C29  value 100nF  [C0402]  (hidden comment: C0402C104K3RACTU)
C30  value 100nF  [C0402]  (hidden comment: C0402C104K3RACTU)
D2  LTST-C195KGJRKT  [SMD LED 0606 DUAL GREEN RED]  (value not drawn)
J3  93626-3006  [93626-3508]  (value not drawn)
J4  651005136421  [USB MiniUSB B Vertical THT]  (value not drawn)
J5  614004135023  [614004135023]  (value not drawn)
J6  416131160802  [416131160802]  (value not drawn)
J7  693072010801  [693072010801]
J8  1060TR  [1060TR]  (value not drawn)
M1  RaspberryPi Compute Module 4  [RaspberryComputeModule4]  (value not drawn)  (parts A,B,C,D of 10)
R5  value 430R  [R0402]  (hidden comment: RC0402FR-07430RL)
R6  value 430R  [R0402]  (hidden comment: RC0402FR-07430RL)
R7  value 220R  [R0402]  (hidden comment: RC0402FR-07220RL)
R8  value 220R  [R0402]  (hidden comment: RC0402FR-07220RL)
R9  value 22.0R  [R0402]  (hidden comment: RC0402FR-0722RL)
R10  value 22.0R  [R0402]  (hidden comment: RC0402FR-0722RL)
R11  value 10.0k  [R0402]  (hidden comment: RC0402FR-0710KL)
R12  value 10.0k  [R0402]  (hidden comment: RC0402FR-0710KL)
R13  value 10.0k  [R0402]  (hidden comment: RC0402FR-0710KL)
R14  value 10.0k  [R0402]  (hidden comment: RC0402FR-0710KL)
U3  24LC512-I/SN  [soic-8]
U4  DS3231MZ+  [SOIC-8]

### Blocks framed on the sheet
Gigabit Ethernet: C24 C25 J3 M1 R5 R6
MicroSD Card (SPI Mode, no license fee): C30 J7
Pull resistors: R11-R14
I2C RealTimeClock and EEPROM: C27-C29 J8 U3 U4

### Ports
Board_Reset (out), CM_GPIO_00 (bidir), CM_GPIO_01 (bidir), CM_GPIO_02 (bidir), CM_RX_FPGA (in), CM_RX_FTDI (in), CM_TX_FPGA (out), CM_TX_FTDI (out), Con_RX_FTDI (in), Con_TX_FTDI (out), FPGA_State (bidir), FPGA_TCK (out), FPGA_TDI (out), FPGA_TDO (in), FPGA_TMS (out), mC_Boot (out), mC_State (bidir), WatchDog (out)

### Nets
+3.3V: C28.2 C29.2 C30.2 D2.1(AG) D2.2(AR) J3.11(GA) J3.13(YA) J7.4(VDD) M1.78(GPIO_VREF) R11.1 R12.1 R13.1 R14.1 U3.8(VCC) U4.2(VCC)
+3.3V_CM: M1.84(+3.3V_Output) M1.86(+3.3V_Output)
+5.0V: J5.1(VCC)
+5.0V_CM: M1.77(+5V) M1.79(+5V) M1.81(+5V) M1.83(+5V) M1.85(+5V) M1.87(+5V)
GND: C24.2 C25.1 C26.2 C27.1 C28.1 C29.1 C30.1 J3.10(GND) J4.5(GND) J5.4(GND) J6.R2 J7.6(VSS) J7.Shield J8.- M1.1(GND) M1.2(GND) M1.7(GND) M1.8(GND) M1.13(GND) M1.14(GND) M1.22(GND) M1.23(GND) M1.32(GND) M1.33(GND) M1.42(GND) M1.43(GND) M1.52(GND) M1.53(GND) M1.59(GND) M1.60(GND) M1.65(GND) M1.66(GND) M1.71(GND) M1.74(GND) M1.98(GND) M1.107(GND) M1.108(GND) M1.113(GND) M1.114(GND) M1.119(GND) M1.120(GND) M1.125(GND) M1.131(GND) M1.132(GND) M1.137(GND) M1.138(GND) M1.144(GND) M1.150(GND) M1.155(GND) M1.156(GND) M1.161(GND) M1.162(GND) M1.167(GND) M1.168(GND) M1.173(GND) M1.174(GND) M1.179(GND) M1.180(GND) M1.185(GND) M1.186(GND) M1.191(GND) M1.192(GND) M1.197(GND) M1.198(GND) U3.1(A0) U3.2(A1) U3.3(A2) U3.4(VSS) U3.7(WP) U4.5(GND)
Board_Reset: M1.48(GPIO27) R14.2 ; port Board_Reset
CM_GPIO00: M1.30(GPIO06) ; port CM_GPIO_00
CM_GPIO01: M1.37(GPIO07) ; port CM_GPIO_01
CM_GPIO02: M1.29(GPIO16) ; port CM_GPIO_02
CM_RX_FPGA: M1.28(GPIO13) ; port CM_RX_FPGA
CM_RX_FTDI: M1.34(GPIO05) ; port CM_RX_FTDI
CM_TX_FPGA: M1.31(GPIO12) ; port CM_TX_FPGA
CM_TX_FTDI: M1.54(GPIO04) ; port CM_TX_FTDI
Con_RX_FTDI: M1.51(GPIO15) ; port Con_RX_FTDI
Con_TX_FTDI: M1.55(GPIO14) ; port Con_TX_FTDI
FPGA_State: M1.46(GPIO22) ; port FPGA_State
FPGA_TCK: M1.25(GPIO21) ; port FPGA_TCK
FPGA_TDI: M1.27(GPIO20) ; port FPGA_TDI
FPGA_TDO: M1.26(GPIO19) ; port FPGA_TDO
FPGA_TMS: M1.49(GPIO18) ; port FPGA_TMS
I2C_SCL: M1.56(GPIO03) R12.2 U3.6(SCL) U4.8(SCL)
I2C_SDA: M1.58(GPIO02) R13.2 U3.5(SDA) U4.7(SDA)
mC_Boot: M1.24(GPIO26) ; port mC_Boot
mC_State: M1.41(GPIO25) ; port mC_State
Pair0_N: J3.3(MD0-) M1.10(Ethernet_Pair0_N)
Pair0_P: J3.2(MD0+) M1.12(Ethernet_Pair0_P)
Pair1_N: J3.7(MD1-) M1.6(Ethernet_Pair1_N)
Pair1_P: J3.4(MD1+) M1.4(Ethernet_Pair1_P)
Pair2_N: J3.6(MD2-) M1.9(Ethernet_Pair2_N)
Pair2_P: J3.5(MD2+) M1.11(Ethernet_Pair2_P)
Pair3_N: J3.9(MD3-) M1.5(Ethernet_Pair3_N)
Pair3_P: J3.8(MD3+) M1.3(Ethernet_Pair3_P)
SDCard_MISO: J7.7(DAT0_[MISO]) M1.40(GPIO09)
SDCard_MOSI: J7.3(CMD_[MOSI]) M1.44(GPIO10)
SDCard_nCS: J7.2(CD/DAT3_[nCS]) M1.39(GPIO08) R11.2
SDCard_SCLK: J7.5(CLK_[SCLK]) M1.38(GPIO11)
USB_N: M1.103(USB2_N) R10.1
USB_P: M1.105(USB2_P) R9.1
WatchDog: M1.50(GPIO17) ; port WatchDog
NetC24_1: C24.1 J3.1(CT)
NetC25_2: C25.2 J3.S(SHIELD)
NetC26_1: C26.1 J4.S(Shield) J5.S(Shield)
NetC27_2: C27.2 J8.+ U4.6(VBAT)
NetD2_3: D2.3(KG) R8.2
NetD2_4: D2.4(KR) R7.2
NetJ3_12: J3.12 R6.2
NetJ3_14: J3.14(YK) R5.2
NetJ4_2: J4.2(D-) J5.2(D-) R10.2
NetJ4_3: J4.3(D+) J5.3(D+) R9.2
NetJ6_L2: J6.L2 M1.93(nRPIBOOT)
NetM1_15: M1.15(Ethernet_nLED3(3.3V)) R6.1
NetM1_17: M1.17(Ethernet_nLED2(3.3V)) R5.1
NetM1_45: M1.45(GPIO24) R8.1
NetM1_47: M1.47(GPIO23) R7.1

Not connected (* = marked no-connect by the designer): J4 1(VCC)*; J6 L1* R1*; J7 1(DAT2)* 8(DAT1)*; M1 16(Ethernet_SYNC_IN(1.8V))* 18(Ethernet_SYNC_OUT(1.8V))* 19(Ethernet_nLED1(3.3V)) 88(+1.8V_Output)* 90(+1.8V_Output)* 101(USB_OTG_ID)*; U4 1(32kHz)* 3(nInt/SQW)* 4(nRST)*

### Layout directives
differential pair: Pair0_N, Pair0_P, Pair1_N, Pair1_P, Pair2_N, Pair2_P, Pair3_N, Pair3_P, USB_N, USB_P

### Notes on the sheet
- KOM ACB23 4009
- Compute module 4 with its peripherals.
- Compute Module 4
- I2C1 <=> RTC / EEPROM
- v0.11
- UART3 <=> FTDI
- UART5 <=> FPGA
- SPI0 <=> SD Card
- UART0 Console <=> FTDI
- USB Slave / Host
- SPI1 <=> FPGA JTAG
- Slave
- Host
- Title
- Size:
- Date:
- A4
- Number:
- Time:
- Revision:
- Sheet
- of
- Vietzke Engineering
- Rosengasse 21
- 98693 Ilmenau
- Confidential
- File:
- (in symbol 24LC512-I/SN) I2C EEPROM; 1010 A2 A1 A0 x
- (in symbol 1060TR) CR2032
- (in symbol 416131160802) ON
- (in symbol DS3231MZ+) RealTimeClock; 1101000x
- (in symbol RaspberryPi Compute Module 4, part A) GPIO
- (in symbol RaspberryPi Compute Module 4, part B) Ethernet
- (in symbol RaspberryPi Compute Module 4, part C) Power
- (in symbol RaspberryPi Compute Module 4, part D) USB

### Library data of the parts
C24 C27-C30 = C0402C104K3RACTU: 0402 100nF 25.0V; Type: SMD; Package: 0402; Supplier 1: Mouser; Supplier Part Number 1: 80-C0402C104K3R
C25 C26 = CC1206KKX7RSBB102: 1206 1nF 2.5kV; Type: SMD; Package: 1206; Supplier 1: Mouser; Supplier Part Number 1: 603-CC1206KKX7RSBB10
D2 = LTST-C195KGJRKT: SMD LED 0606 Dual RED GREEN; Type: SMD; Package: 0603; Supplier 1: Mouser; Supplier Part Number 1: 859-LTST-C195KGJRKT
J3 = 93626-3006: RJ45 MagJack 1Gbit; Type: THT; Package: -; Supplier 1: Mouser; Supplier Part Number 1: 538-93626-3006
J4 = 651005136421: MiniUSB B Female Vertical THT; Type: THT; Supplier 1: Mouser; Supplier Part Number 1: 710-651005136421
J5 = 614004135023: USB A Female Vertical THT; Type: THT; Package: -; Supplier 1: Mouser; Supplier Part Number 1: 710-614004135023; Supplier 2: Digi-Key; Supplier Part Number 2: 732-2732-ND
J6 = 416131160802: DIP switch SMD 2P; Type: SMD; Supplier 1: Mouser; Supplier Part Number 1: 710-416131160802
J7 = 693072010801: WR-CRD Micro SD Card Connector; Type: SMD; Supplier 1: Mouser; Supplier Part Number 1: 710-693072010801
J8 = 1060TR: Knopfzellen-Batteriehalter SMD; Type: SMD; Package: -; Supplier 1: Mouser; Supplier Part Number 1: 534-1060TR
M1 = RaspberryPi Compute Module 4: Compute Module 4 Socket; Type: SMD; Package: -; Supplier 1: Mouser; Supplier Part Number 1: 798-DF40C100DS0.4V51
R5 R6 = RC0402FR-07430RL: 0402 430R; Type: SMD; Package: 0402; Supplier 1: Mouser; Supplier Part Number 1: 603-RC0402FR-07430RL
R7 R8 = RC0402FR-07220RL: 0402 220R; Type: SMD; Package: 0402; Supplier 1: Mouser; Supplier Part Number 1: 603-RC0402FR-07220RL
R9 R10 = RC0402FR-0722RL: 0402 22.0R; Type: SMD; Package: 0402; Supplier 1: Mouser; Supplier Part Number 1: 603-RC0402FR-0722RL
R11-R14 = RC0402FR-0710KL: 0402 10.0K; Type: SMD; Package: 0402; Supplier 1: Mouser; Supplier Part Number 1: 603-RC0402FR-0710KL
U3 = 24LC512-I/SN: I2C EEPROM with 64kBit Memory; Type: SMD; Package: SOIC-8; Supplier 1: Mouser; Supplier Part Number 1: 579-24LC512-I/SN
U4 = DS3231MZ+: Extremely Accurate I2C-IntegratedRTC/TCXO/Crystal; Type: SMD; Supplier 1: Mouser; Supplier Part Number 1: 700-DS3231MZ+

## Sheet 08_KOM_ACB23_4009_Connectors.SchDoc: Connectors
size A4; DocumentNumber: 2023-03-28; Revision: v0.11; SheetNumber: 8; SheetTotal: 9
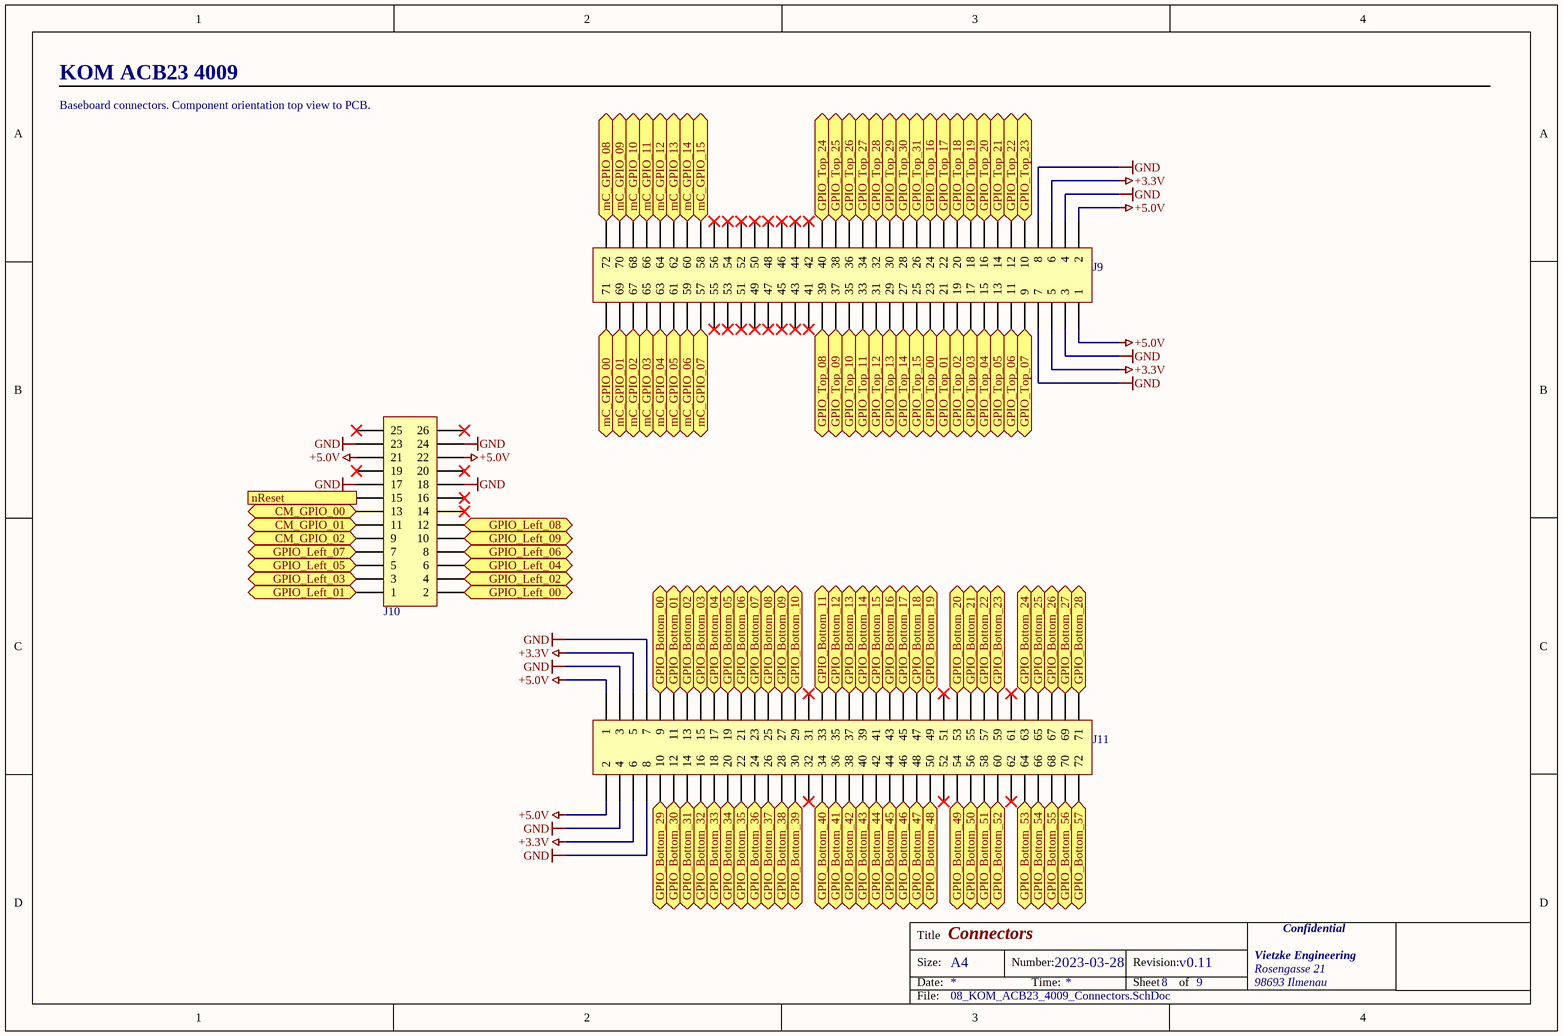
[diagram p7: 08_KOM_ACB23_4009_Connectors.SchDoc]

### Parts
J9  77313-424-72LF  [Pinheader 02x36]  (value not drawn)
J10  75844-127-26LF  [Pinheader 02x13]  (value not drawn)
J11  77313-424-72LF  [Pinheader 02x36]  (value not drawn)

### Ports
CM_GPIO_00 (bidir), CM_GPIO_01 (bidir), CM_GPIO_02 (bidir), GPIO_Bottom_00 (bidir), GPIO_Bottom_01 (bidir), GPIO_Bottom_02 (bidir), GPIO_Bottom_03 (bidir), GPIO_Bottom_04 (bidir), GPIO_Bottom_05 (bidir), GPIO_Bottom_06 (bidir), GPIO_Bottom_07 (bidir), GPIO_Bottom_08 (bidir), GPIO_Bottom_09 (bidir), GPIO_Bottom_10 (bidir), GPIO_Bottom_11 (bidir), GPIO_Bottom_12 (bidir), GPIO_Bottom_13 (bidir), GPIO_Bottom_14 (bidir), GPIO_Bottom_15 (bidir), GPIO_Bottom_16 (bidir), GPIO_Bottom_17 (bidir), GPIO_Bottom_18 (bidir), GPIO_Bottom_19 (bidir), GPIO_Bottom_20 (bidir), GPIO_Bottom_21 (bidir), GPIO_Bottom_22 (bidir), GPIO_Bottom_23 (bidir), GPIO_Bottom_24 (bidir), GPIO_Bottom_25 (bidir), GPIO_Bottom_26 (bidir), GPIO_Bottom_27 (bidir), GPIO_Bottom_28 (bidir), GPIO_Bottom_29 (bidir), GPIO_Bottom_30 (bidir), GPIO_Bottom_31 (bidir), GPIO_Bottom_32 (bidir), GPIO_Bottom_33 (bidir), GPIO_Bottom_34 (bidir), GPIO_Bottom_35 (bidir), GPIO_Bottom_36 (bidir), GPIO_Bottom_37 (bidir), GPIO_Bottom_38 (bidir), GPIO_Bottom_39 (bidir), GPIO_Bottom_40 (bidir), GPIO_Bottom_41 (bidir), GPIO_Bottom_42 (bidir), GPIO_Bottom_43 (bidir), GPIO_Bottom_44 (bidir), GPIO_Bottom_45 (bidir), GPIO_Bottom_46 (bidir), GPIO_Bottom_47 (bidir), GPIO_Bottom_48 (bidir), GPIO_Bottom_49 (bidir), GPIO_Bottom_50 (bidir), GPIO_Bottom_51 (bidir), GPIO_Bottom_52 (bidir), GPIO_Bottom_53 (bidir), GPIO_Bottom_54 (bidir), GPIO_Bottom_55 (bidir), GPIO_Bottom_56 (bidir), GPIO_Bottom_57 (bidir), GPIO_Left_00 (bidir), GPIO_Left_01 (bidir), GPIO_Left_02 (bidir), GPIO_Left_03 (bidir), GPIO_Left_04 (bidir), GPIO_Left_05 (bidir), GPIO_Left_06 (bidir), GPIO_Left_07 (bidir), GPIO_Left_08 (bidir), GPIO_Left_09 (bidir), GPIO_Top_00 (bidir), GPIO_Top_01 (bidir), GPIO_Top_02 (bidir), GPIO_Top_03 (bidir), GPIO_Top_04 (bidir), GPIO_Top_05 (bidir), GPIO_Top_06 (bidir), GPIO_Top_07 (bidir), GPIO_Top_08 (bidir), GPIO_Top_09 (bidir), GPIO_Top_10 (bidir), GPIO_Top_11 (bidir), GPIO_Top_12 (bidir), GPIO_Top_13 (bidir), GPIO_Top_14 (bidir), GPIO_Top_15 (bidir), GPIO_Top_16 (bidir), GPIO_Top_17 (bidir), GPIO_Top_18 (bidir), GPIO_Top_19 (bidir), GPIO_Top_20 (bidir), GPIO_Top_21 (bidir), GPIO_Top_22 (bidir), GPIO_Top_23 (bidir), GPIO_Top_24 (bidir), GPIO_Top_25 (bidir), GPIO_Top_26 (bidir), GPIO_Top_27 (bidir), GPIO_Top_28 (bidir), GPIO_Top_29 (bidir), GPIO_Top_30 (bidir), GPIO_Top_31 (bidir), mC_GPIO_00 (bidir), mC_GPIO_01 (bidir), mC_GPIO_02 (bidir), mC_GPIO_03 (bidir), mC_GPIO_04 (bidir), mC_GPIO_05 (bidir), mC_GPIO_06 (bidir), mC_GPIO_07 (bidir), mC_GPIO_08 (bidir), mC_GPIO_09 (bidir), mC_GPIO_10 (bidir), mC_GPIO_11 (bidir), mC_GPIO_12 (bidir), mC_GPIO_13 (bidir), mC_GPIO_14 (bidir), mC_GPIO_15 (bidir), nReset (in)

### Nets
+3.3V: J9.5 J9.6 J11.5 J11.6
+5.0V: J9.1 J9.2 J10.21 J10.22 J11.1 J11.2
GND: J9.3 J9.4 J9.7 J9.8 J10.17 J10.18 J10.23 J10.24 J11.3 J11.4 J11.7 J11.8
CM_GPIO00: J10.13 ; port CM_GPIO_00
CM_GPIO01: J10.11 ; port CM_GPIO_01
CM_GPIO02: J10.9 ; port CM_GPIO_02
mC_GPIO_00: J9.71 ; port mC_GPIO_00
mC_GPIO_01: J9.69 ; port mC_GPIO_01
mC_GPIO_02: J9.67 ; port mC_GPIO_02
mC_GPIO_03: J9.65 ; port mC_GPIO_03
mC_GPIO_04: J9.63 ; port mC_GPIO_04
mC_GPIO_05: J9.61 ; port mC_GPIO_05
mC_GPIO_06: J9.59 ; port mC_GPIO_06
mC_GPIO_07: J9.57 ; port mC_GPIO_07
mC_GPIO_08: J9.72 ; port mC_GPIO_08
mC_GPIO_09: J9.70 ; port mC_GPIO_09
mC_GPIO_10: J9.68 ; port mC_GPIO_10
mC_GPIO_11: J9.66 ; port mC_GPIO_11
mC_GPIO_12: J9.64 ; port mC_GPIO_12
mC_GPIO_13: J9.62 ; port mC_GPIO_13
mC_GPIO_14: J9.60 ; port mC_GPIO_14
mC_GPIO_15: J9.58 ; port mC_GPIO_15
nReset: J10.15 ; port nReset
NetJ9_9: J9.9 ; port GPIO_Top_07
NetJ9_10: J9.10 ; port GPIO_Top_23
NetJ9_11: J9.11 ; port GPIO_Top_06
NetJ9_12: J9.12 ; port GPIO_Top_22
NetJ9_13: J9.13 ; port GPIO_Top_05
NetJ9_14: J9.14 ; port GPIO_Top_21
NetJ9_15: J9.15 ; port GPIO_Top_04
NetJ9_16: J9.16 ; port GPIO_Top_20
NetJ9_17: J9.17 ; port GPIO_Top_03
NetJ9_18: J9.18 ; port GPIO_Top_19
NetJ9_19: J9.19 ; port GPIO_Top_02
NetJ9_20: J9.20 ; port GPIO_Top_18
NetJ9_21: J9.21 ; port GPIO_Top_01
NetJ9_22: J9.22 ; port GPIO_Top_17
NetJ9_23: J9.23 ; port GPIO_Top_00
NetJ9_24: J9.24 ; port GPIO_Top_16
NetJ9_25: J9.25 ; port GPIO_Top_15
NetJ9_26: J9.26 ; port GPIO_Top_31
NetJ9_27: J9.27 ; port GPIO_Top_14
NetJ9_28: J9.28 ; port GPIO_Top_30
NetJ9_29: J9.29 ; port GPIO_Top_13
NetJ9_30: J9.30 ; port GPIO_Top_29
NetJ9_31: J9.31 ; port GPIO_Top_12
NetJ9_32: J9.32 ; port GPIO_Top_28
NetJ9_33: J9.33 ; port GPIO_Top_11
NetJ9_34: J9.34 ; port GPIO_Top_27
NetJ9_35: J9.35 ; port GPIO_Top_10
NetJ9_36: J9.36 ; port GPIO_Top_26
NetJ9_37: J9.37 ; port GPIO_Top_09
NetJ9_38: J9.38 ; port GPIO_Top_25
NetJ9_39: J9.39 ; port GPIO_Top_08
NetJ9_40: J9.40 ; port GPIO_Top_24
NetJ10_1: J10.1 ; port GPIO_Left_01
NetJ10_2: J10.2 ; port GPIO_Left_00
NetJ10_3: J10.3 ; port GPIO_Left_03
NetJ10_4: J10.4 ; port GPIO_Left_02
NetJ10_5: J10.5 ; port GPIO_Left_05
NetJ10_6: J10.6 ; port GPIO_Left_04
NetJ10_7: J10.7 ; port GPIO_Left_07
NetJ10_8: J10.8 ; port GPIO_Left_06
NetJ10_10: J10.10 ; port GPIO_Left_09
NetJ10_12: J10.12 ; port GPIO_Left_08
NetJ11_9: J11.9 ; port GPIO_Bottom_00
NetJ11_10: J11.10 ; port GPIO_Bottom_29
NetJ11_11: J11.11 ; port GPIO_Bottom_01
NetJ11_12: J11.12 ; port GPIO_Bottom_30
NetJ11_13: J11.13 ; port GPIO_Bottom_02
NetJ11_14: J11.14 ; port GPIO_Bottom_31
NetJ11_15: J11.15 ; port GPIO_Bottom_03
NetJ11_16: J11.16 ; port GPIO_Bottom_32
NetJ11_17: J11.17 ; port GPIO_Bottom_04
NetJ11_18: J11.18 ; port GPIO_Bottom_33
NetJ11_19: J11.19 ; port GPIO_Bottom_05
NetJ11_20: J11.20 ; port GPIO_Bottom_34
NetJ11_21: J11.21 ; port GPIO_Bottom_06
NetJ11_22: J11.22 ; port GPIO_Bottom_35
NetJ11_23: J11.23 ; port GPIO_Bottom_07
NetJ11_24: J11.24 ; port GPIO_Bottom_36
NetJ11_25: J11.25 ; port GPIO_Bottom_08
NetJ11_26: J11.26 ; port GPIO_Bottom_37
NetJ11_27: J11.27 ; port GPIO_Bottom_09
NetJ11_28: J11.28 ; port GPIO_Bottom_38
NetJ11_29: J11.29 ; port GPIO_Bottom_10
NetJ11_30: J11.30 ; port GPIO_Bottom_39
NetJ11_33: J11.33 ; port GPIO_Bottom_11
NetJ11_34: J11.34 ; port GPIO_Bottom_40
NetJ11_35: J11.35 ; port GPIO_Bottom_12
NetJ11_36: J11.36 ; port GPIO_Bottom_41
NetJ11_37: J11.37 ; port GPIO_Bottom_13
NetJ11_38: J11.38 ; port GPIO_Bottom_42
NetJ11_39: J11.39 ; port GPIO_Bottom_14
NetJ11_40: J11.40 ; port GPIO_Bottom_43
NetJ11_41: J11.41 ; port GPIO_Bottom_15
NetJ11_42: J11.42 ; port GPIO_Bottom_44
NetJ11_43: J11.43 ; port GPIO_Bottom_16
NetJ11_44: J11.44 ; port GPIO_Bottom_45
NetJ11_45: J11.45 ; port GPIO_Bottom_17
NetJ11_46: J11.46 ; port GPIO_Bottom_46
NetJ11_47: J11.47 ; port GPIO_Bottom_18
NetJ11_48: J11.48 ; port GPIO_Bottom_47
NetJ11_49: J11.49 ; port GPIO_Bottom_19
NetJ11_50: J11.50 ; port GPIO_Bottom_48
NetJ11_53: J11.53 ; port GPIO_Bottom_20
NetJ11_54: J11.54 ; port GPIO_Bottom_49
NetJ11_55: J11.55 ; port GPIO_Bottom_21
NetJ11_56: J11.56 ; port GPIO_Bottom_50
NetJ11_57: J11.57 ; port GPIO_Bottom_22
NetJ11_58: J11.58 ; port GPIO_Bottom_51
NetJ11_59: J11.59 ; port GPIO_Bottom_23
NetJ11_60: J11.60 ; port GPIO_Bottom_52
NetJ11_63: J11.63 ; port GPIO_Bottom_24
NetJ11_64: J11.64 ; port GPIO_Bottom_53
NetJ11_65: J11.65 ; port GPIO_Bottom_25
NetJ11_66: J11.66 ; port GPIO_Bottom_54
NetJ11_67: J11.67 ; port GPIO_Bottom_26
NetJ11_68: J11.68 ; port GPIO_Bottom_55
NetJ11_69: J11.69 ; port GPIO_Bottom_27
NetJ11_70: J11.70 ; port GPIO_Bottom_56
NetJ11_71: J11.71 ; port GPIO_Bottom_28
NetJ11_72: J11.72 ; port GPIO_Bottom_57

Not connected (* = marked no-connect by the designer): J9 41* 42* 43* 44* 45* 46* 47* 48* 49* 50* 51* 52* 53* 54* 55* 56*; J10 14* 16* 19* 20* 25* 26*; J11 31* 32* 51* 52* 61* 62*

### Notes on the sheet
- KOM ACB23 4009
- Baseboard connectors. Component orientation top view to PCB.
- Title
- Size:
- Date:
- A4
- Number:
- Time:
- Revision:
- Sheet
- of
- Vietzke Engineering
- Rosengasse 21
- 98693 Ilmenau
- Confidential
- File:

### Library data of the parts
J9 J11 = 77313-424-72LF: Pinheader 02x36 Male THT; Type: THT; Package: -; Supplier 1: Mouser; Supplier Part Number 1: 649-77313-424-72LF
J10 = 75844-127-26LF: Pinheader 02x13 Male THT; Type: THT; Package: -; Supplier 1: Mouser; Supplier Part Number 1: 649-75844-127-26LF

## Sheet 09_KOM_ACB23_4009_Periphery.SchDoc: Periphery
size A4; DocumentNumber: 2023-03-28; Revision: v0.11; SheetNumber: 9; SheetTotal: 9
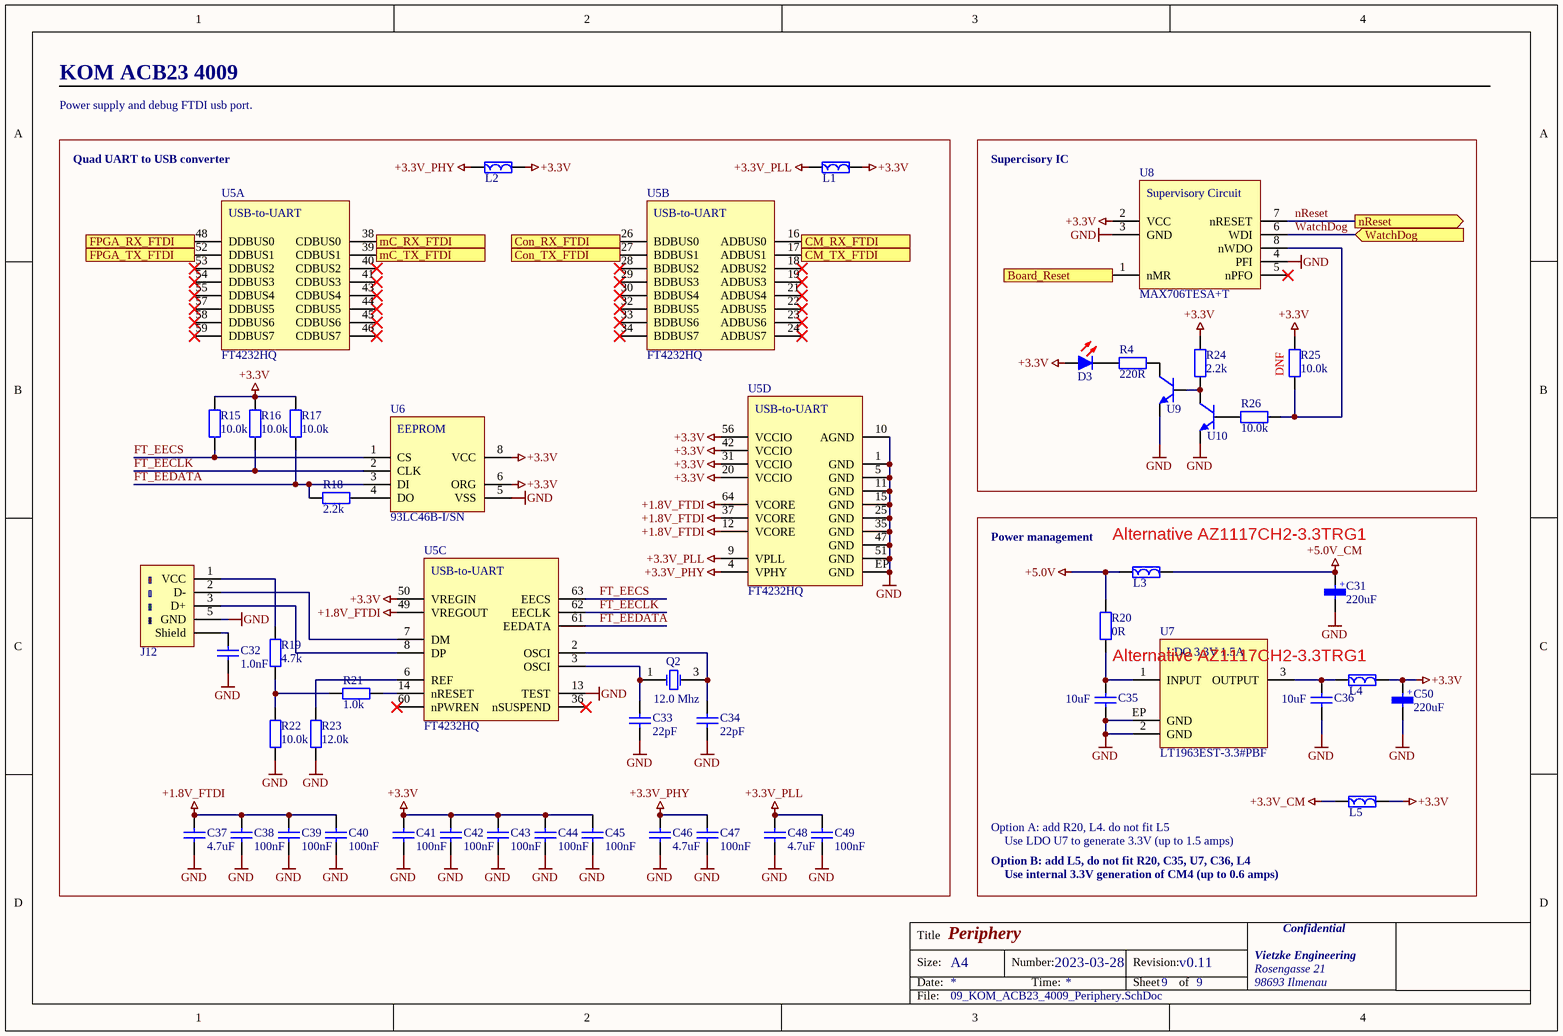
[diagram p8: 09_KOM_ACB23_4009_Periphery.SchDoc]

### Parts
C31  value 220uF  [TANTAL_7343]  (hidden comment: T491D227K010AT)
C32  value 1.0nF  [C1206]  (hidden comment: CC1206KKX7RSBB102)
C33  value 22pF  [C0402]  (hidden comment: C0402C220J4GACAUTO)
C34  value 22pF  [C0402]  (hidden comment: C0402C220J4GACAUTO)
C35  value 10uF  [C0603]  (hidden comment: JMK107BJ106MA-T)
C36  value 10uF  [C0603]  (hidden comment: JMK107BJ106MA-T)
C37  value 4.7uF  [C0402]  (hidden comment: GRM153R60J475ME15D)
C38  value 100nF  [C0402]  (hidden comment: C0402C104K3RACTU)
C39  value 100nF  [C0402]  (hidden comment: C0402C104K3RACTU)
C40  value 100nF  [C0402]  (hidden comment: C0402C104K3RACTU)
C41  value 100nF  [C0402]  (hidden comment: C0402C104K3RACTU)
C42  value 100nF  [C0402]  (hidden comment: C0402C104K3RACTU)
C43  value 100nF  [C0402]  (hidden comment: C0402C104K3RACTU)
C44  value 100nF  [C0402]  (hidden comment: C0402C104K3RACTU)
C45  value 100nF  [C0402]  (hidden comment: C0402C104K3RACTU)
C46  value 4.7uF  [C0402]  (hidden comment: GRM153R60J475ME15D)
C47  value 100nF  [C0402]  (hidden comment: C0402C104K3RACTU)
C48  value 4.7uF  [C0402]  (hidden comment: GRM153R60J475ME15D)
C49  value 100nF  [C0402]  (hidden comment: C0402C104K3RACTU)
C50  value 220uF  [TANTAL_7343]  (hidden comment: T491D227K010AT)
D3  APT1608EC  [LED 0603 RED]  (value not drawn)
J12  651005136421  [USB MiniUSB B Vertical THT]  (value not drawn)
L1  742792651  [L0603]  (value not drawn)
L2  742792651  [L0603]  (value not drawn)
L3  742792514  [L1812]  (value not drawn)
L4  742792651  [L0603]  (value not drawn)
L5  742792651  [L0603]  (value not drawn)
Q2  value 12.0 Mhz  [Crystal_3.2x2.5]  (hidden comment: ABM8W-12.0000MHZ-7-D1X-T3)
R4  value 220R  [R0402]  (hidden comment: RC0402FR-07220RL)
R15  value 10.0k  [R0402]  (hidden comment: RC0402FR-0710KL)
R16  value 10.0k  [R0402]  (hidden comment: RC0402FR-0710KL)
R17  value 10.0k  [R0402]  (hidden comment: RC0402FR-0710KL)
R18  value 2.2k  [R0402]  (hidden comment: RC0402FR-072K2L)
R19  value 4.7k  [R0402]  (hidden comment: RC0402FR-074K7L)
R20  value 0R  [R0402]  (hidden comment: RC0402FR-070RL)
R21  value 1.0k  [R0402]  (hidden comment: RC0402FR-071KL)
R22  value 10.0k  [R0402]  (hidden comment: RC0402FR-0710KL)
R23  value 12.0k  [R0402]  (hidden comment: RC0402FR-0712KL)
R24  value 2.2k  [R0402]  (hidden comment: RC0402FR-072K2L)
R25  value 10.0k  [R0402]  (hidden comment: RC0402FR-0710KL)
R26  value 10.0k  [R0402]  (hidden comment: RC0402FR-0710KL)
U5  FT4232HQ  [QFN64_9x9_0.50]  (parts A,B,C,D of 4)
U6  93LC46B-I/SN  [SOIC-8]
U7  LT1963EST-3.3#PBF  [SOT-223-2]
U8  MAX706TESA+T  [SOIC-8]
U9  BC847C,235  [SOT-23-3]  (value not drawn)
U10  BC847C,235  [SOT-23-3]  (value not drawn)

### Blocks framed on the sheet
Quad UART to USB converter: C32-C34 C37-C49 J12 L1 L2 Q2 R15-R19 R21-R23 U5 U6

### Ports
Board_Reset (in), CM_RX_FTDI (out), CM_TX_FTDI (in), Con_RX_FTDI (out), Con_TX_FTDI (in), FPGA_RX_FTDI (out), FPGA_TX_FTDI (in), mC_RX_FTDI (out), mC_TX_FTDI (in), nReset (out), WatchDog (in)

### Nets
+1.8V_FTDI: C37.2 C38.2 C39.2 C40.2 U5.12(VCORE) U5.37(VCORE) U5.49(VREGOUT) U5.64(VCORE)
+3.3V: C41.2 C42.2 C43.2 C44.2 C45.2 C50.1 D3.1(A) L1.2 L2.2 L4.2 L5.2 R15.2 R16.2 R17.2 R24.2 R25.1 U5.20(VCCIO) U5.31(VCCIO) U5.42(VCCIO) U5.50(VREGIN) U5.56(VCCIO) U6.6(ORG) U6.8(VCC) U8.2(VCC)
+3.3V_CM: L5.1
+3.3V_PHY: C46.2 C47.2 L2.1 U5.4(VPHY)
+3.3V_PLL: C48.2 C49.2 L1.1 U5.9(VPLL)
+5.0V: L3.1 R20.2
+5.0V_CM: C31.1 L3.2
GND: C31.2 C32.2 C33.1 C34.1 C35.1 C36.1 C37.1 C38.1 C39.1 C40.1 C41.1 C42.1 C43.1 C44.1 C45.1 C46.1 C47.1 C48.1 C49.1 C50.2 J12.5(GND) R22.1 R23.1 U5.1(GND) U5.5(GND) U5.10(AGND) U5.11(GND) U5.13(TEST) U5.15(GND) U5.25(GND) U5.35(GND) U5.47(GND) U5.51(GND) U5.EP(GND) U6.5(VSS) U7.2(GND) U7.EP(GND) U8.3(GND) U8.4(PFI) U9.2(E) U10.2(E)
Board_Reset: U8.1(nMR) ; port Board_Reset
CM_RX_FTDI: U5.16(ADBUS0) ; port CM_RX_FTDI
CM_TX_FTDI: U5.17(ADBUS1) ; port CM_TX_FTDI
Con_RX_FTDI: U5.26(BDBUS0) ; port Con_RX_FTDI
Con_TX_FTDI: U5.27(BDBUS1) ; port Con_TX_FTDI
FT_EECLK: R16.1 U5.62(EECLK) U6.2(CLK)
FT_EECS: R15.1 U5.63(EECS) U6.1(CS)
FT_EEDATA: R17.1 R18.1 U5.61(EEDATA) U6.3(DI)
mC_RX_FTDI: U5.38(CDBUS0) ; port mC_RX_FTDI
mC_TX_FTDI: U5.39(CDBUS1) ; port mC_TX_FTDI
nReset: U8.7(nRESET) ; port nReset
WatchDog: U8.6(WDI) ; port WatchDog
NetC32_1: C32.1 J12.S(Shield)
NetC33_2: C33.2 Q2.1(OSC1) U5.3(OSCI)
NetC34_2: C34.2 Q2.3(OSC2) U5.2(OSCI)
NetC35_2: C35.2 R20.1 U7.1(INPUT)
NetC36_2: C36.2 L4.1 U7.3(OUTPUT)
NetD3_2: D3.2(K) R4.1
NetJ12_1: J12.1(VCC) R19.2
NetJ12_2: J12.2(D-) U5.7(DM)
NetJ12_3: J12.3(D+) U5.8(DP)
NetR4_2: R4.2 U9.3(C)
NetR18_2: R18.2 U6.4(DO)
NetR19_1: R19.1 R21.1 R22.2
NetR21_2: R21.2 U5.14(nRESET)
NetR23_2: R23.2 U5.6(REF)
NetR24_1: R24.1 U9.1(B) U10.3(C)
NetR25_2: R25.2 R26.1 U8.8(nWDO)
NetR26_2: R26.2 U10.1(B)
NetU2_142: U5.52(DDBUS1) ; port FPGA_TX_FTDI
NetU2_143: U5.48(DDBUS0) ; port FPGA_RX_FTDI

Not connected (* = marked no-connect by the designer): U5 18(ADBUS2)* 19(ADBUS3)* 21(ADBUS4)* 22(ADBUS5)* 23(ADBUS6)* 24(ADBUS7)* 28(BDBUS2)* 29(BDBUS3)* 30(BDBUS4)* 32(BDBUS5)* 33(BDBUS6)* 34(BDBUS7)* 36(nSUSPEND)* 40(CDBUS2)* 41(CDBUS3)* 43(CDBUS4)* 44(CDBUS5)* 45(CDBUS6)* 46(CDBUS7)* 53(DDBUS2)* 54(DDBUS3)* 55(DDBUS4)* 57(DDBUS5)* 58(DDBUS6)* 59(DDBUS7)* 60(nPWREN)*; U8 5(nPFO)*

### Notes on the sheet
- KOM ACB23 4009
- Power supply and debug FTDI usb port.
- Supercisory IC
- (near R25) DNF
- Power management
- Alternative AZ1117CH2-3.3TRG1
- Option A: add R20, L4. do not fit L5
- Use LDO U7 to generate 3.3V (up to 1.5 amps)
- Option B: add L5, do not fit R20, C35, U7, C36, L4
- Use internal 3.3V generation of CM4 (up to 0.6 amps)
- Title
- Size:
- Date:
- A4
- Number:
- Time:
- Revision:
- Sheet
- of
- Vietzke Engineering
- Rosengasse 21
- 98693 Ilmenau
- Confidential
- File:
- (in symbol 93LC46B-I/SN) EEPROM
- (in symbol FT4232HQ, part A) USB-to-UART
- (in symbol FT4232HQ, part B) USB-to-UART
- (in symbol FT4232HQ, part C) USB-to-UART
- (in symbol FT4232HQ, part D) USB-to-UART
- (in symbol LT1963EST-3.3#PBF) LDO 3.3V 1.5A
- (in symbol MAX706TESA+T) Supervisory Circuit
- (in symbol T491D227K010AT) +

### Library data of the parts
C31 C50 = T491D227K010AT: Tantal 7.3x4.3 220uF 10V; Type: SMD; Package: -; Supplier 1: Mouser; Supplier Part Number 1: 80-T491D227K010
C32 = CC1206KKX7RSBB102: 1206 1nF 2.5kV; Type: SMD; Package: 1206; Supplier 1: Mouser; Supplier Part Number 1: 603-CC1206KKX7RSBB10
C33 C34 = C0402C220J4GACAUTO: 0402 22pF 16V; Type: SMD; Package: 0402; Supplier 1: Mouser; Supplier Part Number 1: 80-C0402C220J4GAUTO
C35 C36 = JMK107BJ106MA-T: 0603 10uF 6.3V; Type: SMD; Package: 0603; Supplier 1: Mouser; Supplier Part Number 1: 963-JMK107BJ106MA-T
C37 C46 C48 = GRM153R60J475ME15D: 0402 4.7uF 6.3V; Type: SMD; Package: 0402; Supplier 1: Mouser; Supplier Part Number 1: 81-GRM153R60J475ME5D
C38-C45 C47 C49 = C0402C104K3RACTU: 0402 100nF 25.0V; Type: SMD; Package: 0402; Supplier 1: Mouser; Supplier Part Number 1: 80-C0402C104K3R
D3 = APT1608EC: SMD LED 0603 RED; Type: SMD; Package: 0603; Supplier 1: Mouser; Supplier Part Number 1: 604-APT1608EC
J12 = 651005136421: MiniUSB B Female Vertical THT; Type: THT; Supplier 1: Mouser; Supplier Part Number 1: 710-651005136421
L1 L2 L4 L5 = 742792651: Ferritperle 1A; Type: SMD; Package: 0603; Supplier 1: Mouser; Supplier Part Number 1: 710-742792651
L3 = 742792514: Ferritperle 3A; Type: SMD; Package: 1812; Supplier 1: Mouser; Supplier Part Number 1: 710-742792514
Q2 = ABM8W-12.0000MHZ-7-D1X-T3: Crystal 12 Mhz 3.2 x 2.5; Type: SMD; Package: 3.2x2.5; Supplier 1: Mouser; Supplier Part Number 1: 815-8W12-7D1XT
R4 = RC0402FR-07220RL: 0402 220R; Type: SMD; Package: 0402; Supplier 1: Mouser; Supplier Part Number 1: 603-RC0402FR-07220RL
R15-R17 R22 R25 R26 = RC0402FR-0710KL: 0402 10.0K; Type: SMD; Package: 0402; Supplier 1: Mouser; Supplier Part Number 1: 603-RC0402FR-0710KL
R18 R24 = RC0402FR-072K2L: 0402 2.2K; Type: SMD; Package: 0402; Supplier 1: Mouser; Supplier Part Number 1: 603-RC0402FR-072K2L
R19 = RC0402FR-074K7L: 0402 4.7K; Type: SMD; Package: 0402; Supplier 1: Mouser; Supplier Part Number 1: 603-RC0402FR-074K7L
R20 = RC0402FR-070RL: 0402 0R; Type: SMD; Package: 0402; Supplier 1: Mouser; Supplier Part Number 1: 603-RC0402FR-070RL
R21 = RC0402FR-071KL: 0402 1.0K; Type: SMD; Package: 0402; Supplier 1: Mouser; Supplier Part Number 1: 603-RC0402FR-071KL
R23 = RC0402FR-0712KL: 0402 12.0K; Type: SMD; Package: 0402; Supplier 1: Mouser; Supplier Part Number 1: 603-RC0402FR-0712KL
U5 = FT4232HQ: USB-IC-Schnittstelle USB to Serial UART QuadPort; Type: SMD; Supplier 1: Mouser; Supplier Part Number 1: 895-FT4232HQ
U6 = 93LC46B-I/SN: 1K Microwire Compatible Serial EEPROM; Type: SMD; Supplier 1: Mouser; Supplier Part Number 1: 579-93LC46BISN
U7 = LT1963EST-3.3#PBF: LDO Spannungs-Regulator 1.5A 3.3V; Package: SOT-223-2; Type: SMD; Supplier 1: Mouser; Supplier Part Number 1: 584-LT1963EST-3.3PBF
U8 = MAX706TESA+T: +3V Voltage Monitoring, Low-Cost μP Supervisory Circuit; Type: SMD; Supplier 1: Mouser; Supplier Part Number 1: 700-MAX706TESAT
U9 U10 = BC847C,235: 45 V, 100 mA NPN general-purpose transistor; Package: SOT23; Type: SMD; Supplier 1: Mouser; Supplier Part Number 1: 771-BC847C235